# EasyEDA Pro project 超级电容组_v1.eprj

# Schematic 散热片
Create Date: 2024-05-23; Page Name: P1; Project Name: 超级电容组; Schematic Name: 背面; Update Date: 2024-05-23; Company: 嘉立创EDA; Page Size: A2; Version: V1.0
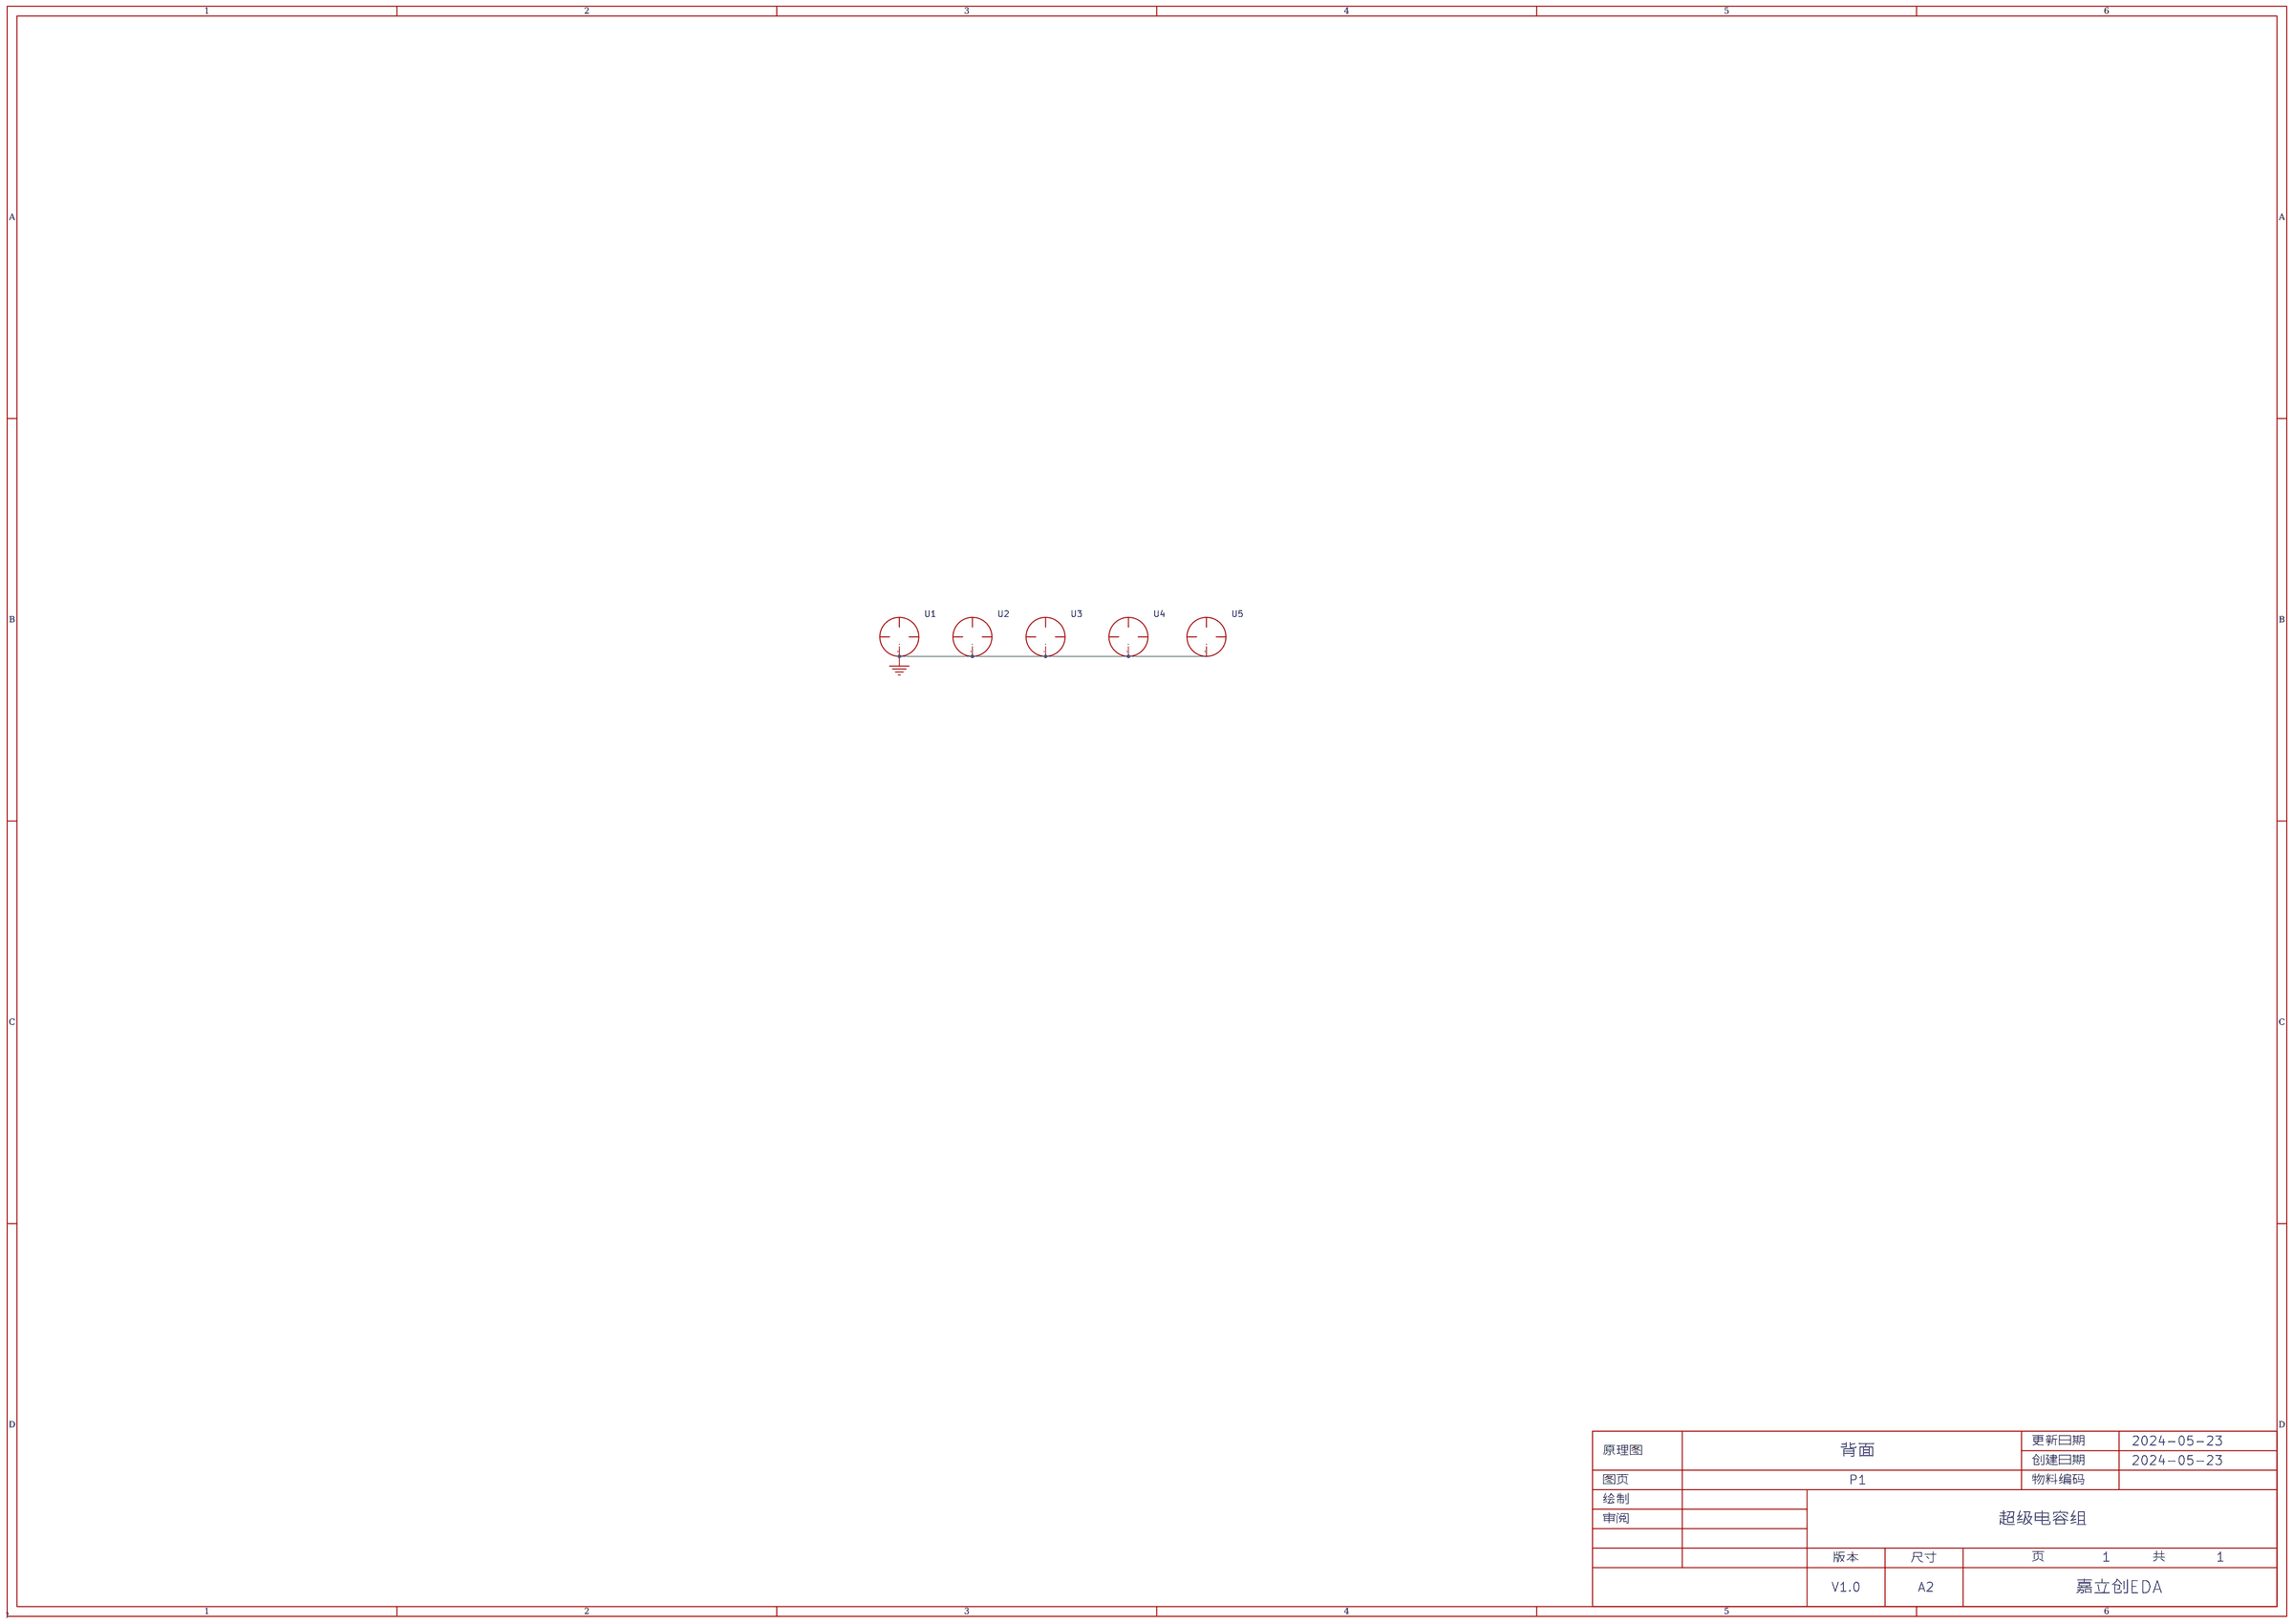
[diagram p0: schematic sheet]

## Parts
U1  -  [M2.5直径4.5高4孔3深1.2PCB螺母]
U2  -  [M2.5直径4.5高4孔3深1.2PCB螺母]
U3  -  [M2.5直径4.5高4孔3深1.2PCB螺母]
U4  -  [M2.5直径4.5高4孔3深1.2PCB螺母]
U5  -  [M2.5直径4.5高4孔3深1.2PCB螺母]

## Library data of the parts
U1-U5 = M2.5_Φ4.5_H4_Hold3*1.2

## Nets
GND: U1.1 U2.1 U3.1 U4.1 U5.1

# Schematic 电容组
Board Name: 电容组V2.0.2342; Create Date: 2023-10-10; Page Name: P1; Project Name: RM2024群星战队7S3V1890J超级电容组; Schematic Name: 电容组; Update Date: 2024-09-09; Company: 嘉立创EDA; Page Size: A2; Version: V1.0
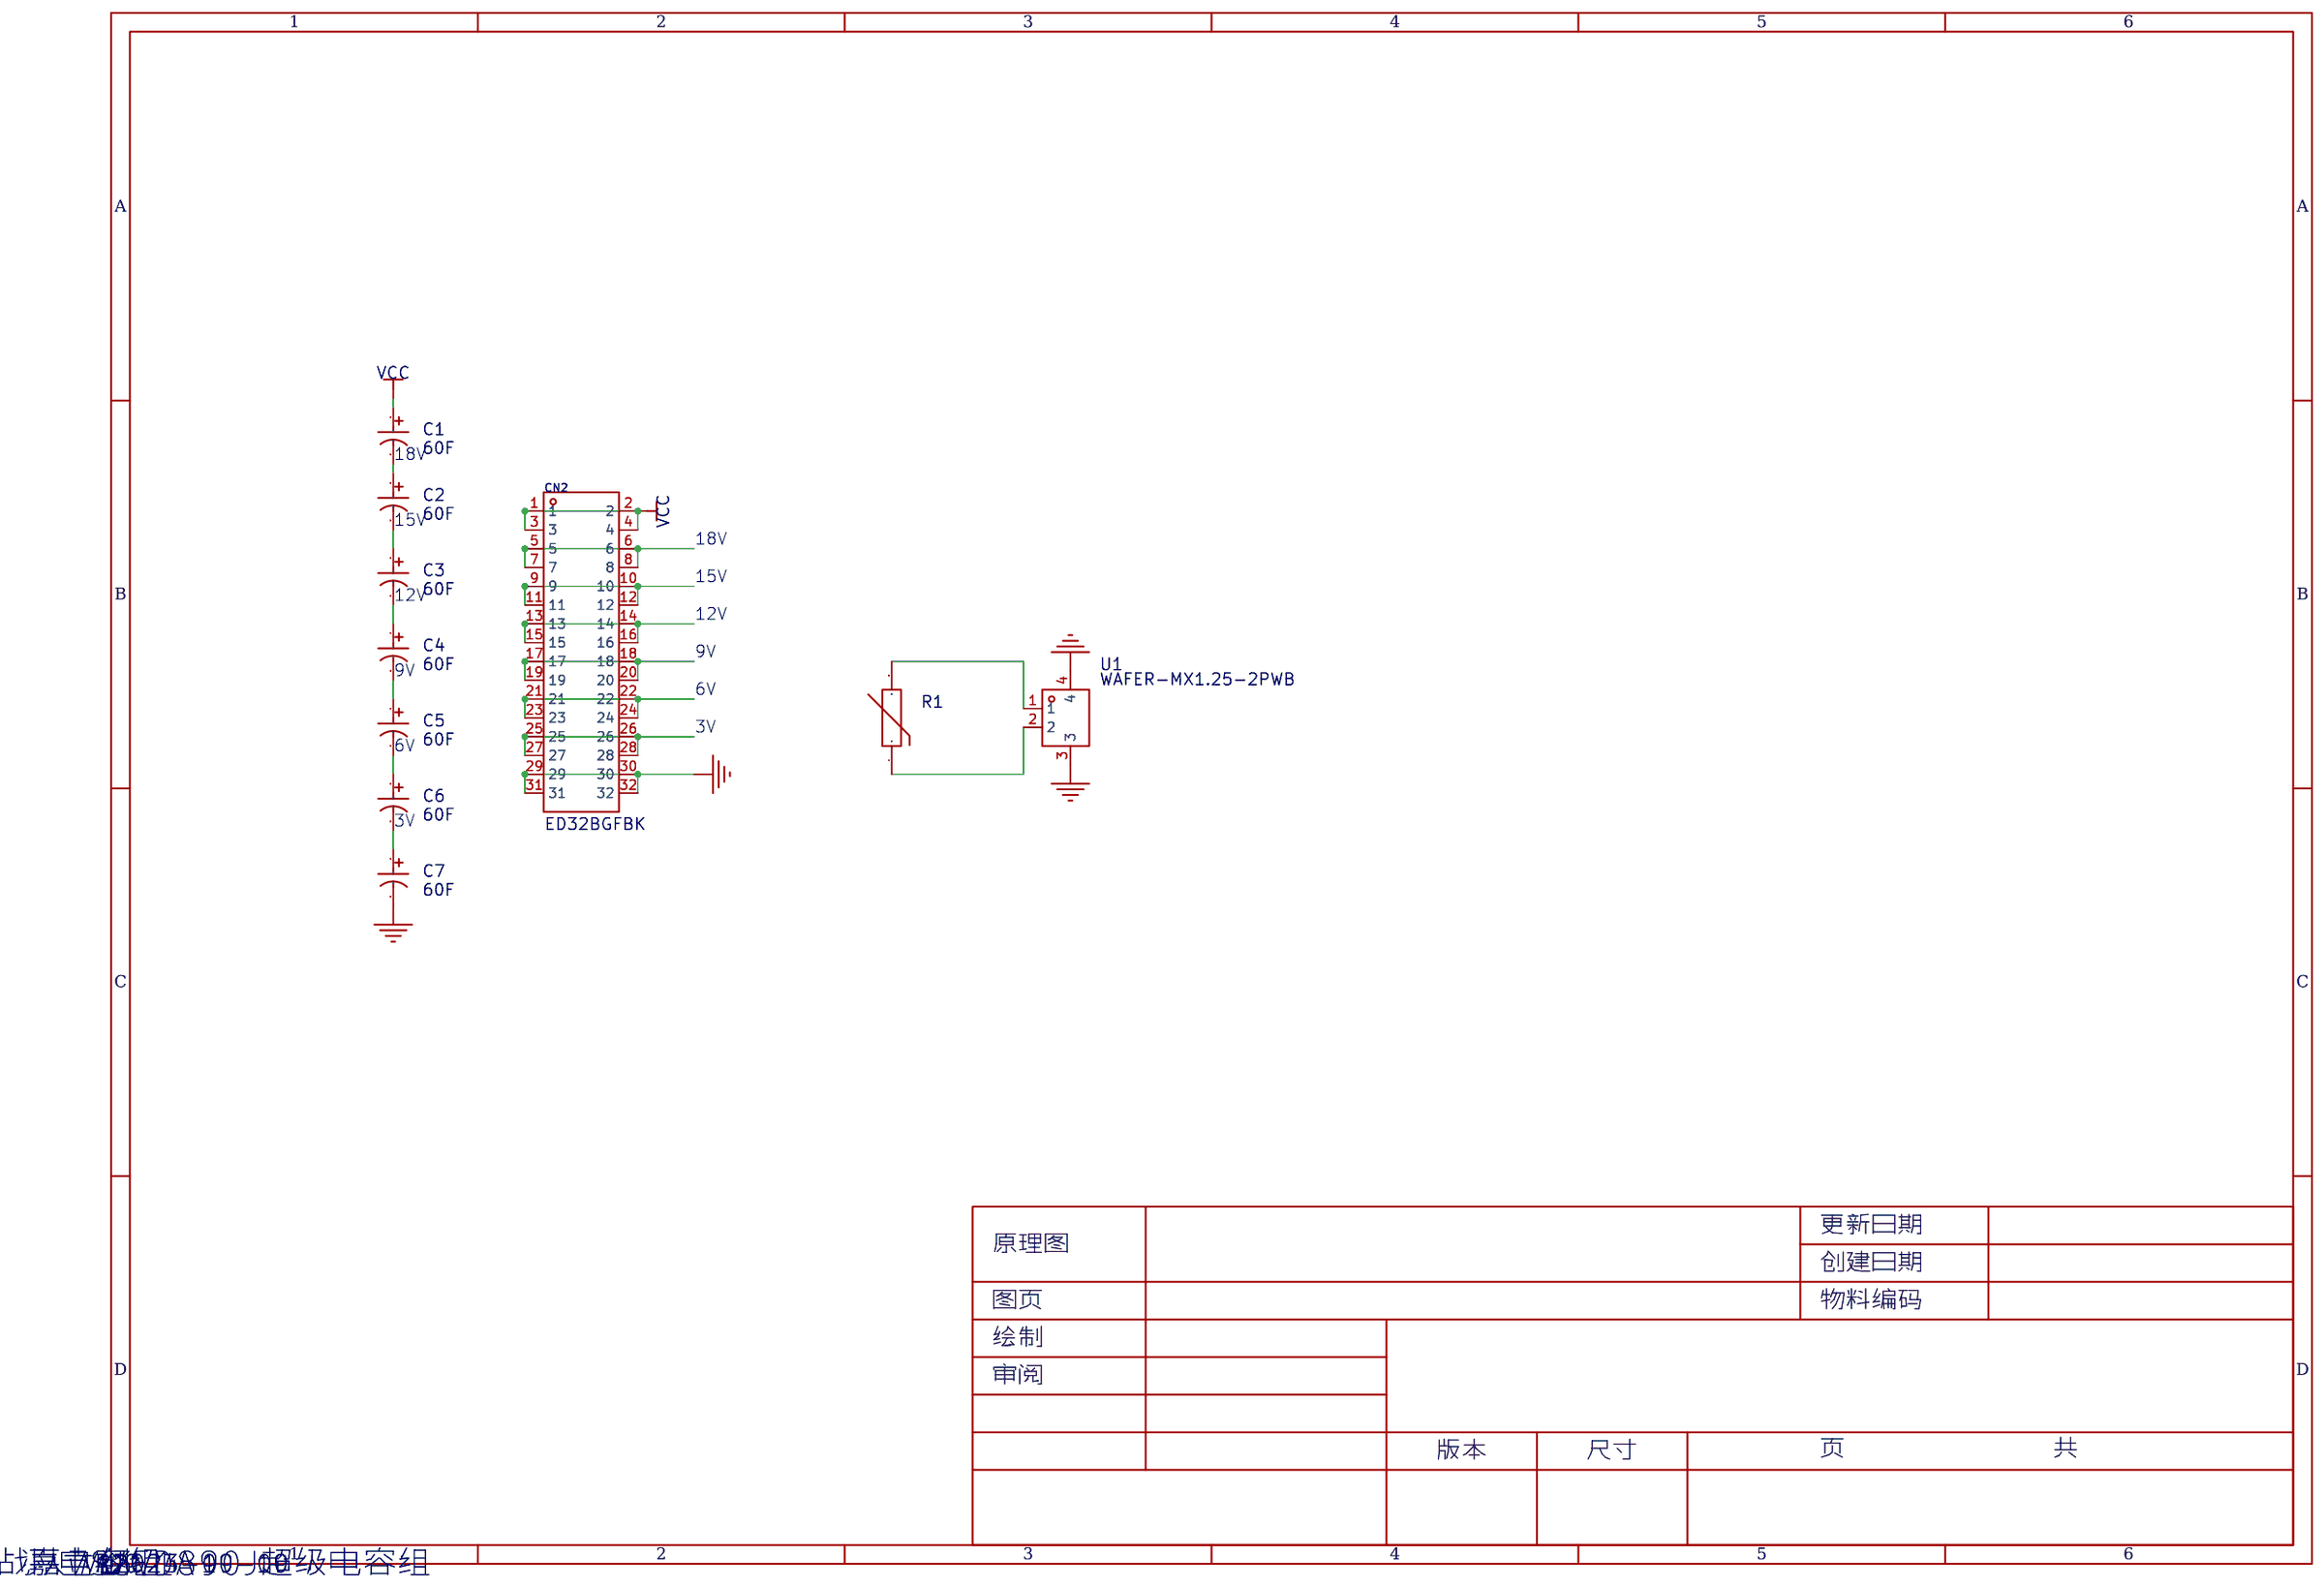
[diagram p1: schematic sheet]

## Parts
C1  60F  [CAP-TH_BD18.0-P7.50-D1.2-FD]
C2  60F  [CAP-TH_BD18.0-P7.50-D1.2-FD]
C3  60F  [CAP-TH_BD18.0-P7.50-D1.2-FD]
C4  60F  [CAP-TH_BD18.0-P7.50-D1.2-FD]
C5  60F  [CAP-TH_BD18.0-P7.50-D1.2-FD]
C6  60F  [CAP-TH_BD18.0-P7.50-D1.2-FD]
C7  60F  [CAP-TH_BD18.0-P7.50-D1.2-FD]
CN2  ED32BGFBK  [CONN-TH_32P-P2.54-ED32BGFBK]
R1  -  [RES-TH_L2.5-W2.5-P1.70-D0.3]
U1  WAFER-MX1.25-2PWB  [CONN-SMD_2P-P1.25_XUNPU_WAFER-MX1.25-2PWB]

## Library data of the parts
C1-C7 = 3V-60F: 容值:60F;精度:-10%~+30%;额定电压:2.7V;漏电流:1mA@72hrs;等效串联电阻:25mΩ@1kHz;; LCSC Part Name: 60F -10%~+30% 2.7V; Supplier Part: C7437611; Manufacturer: HCCCap(合众汇能); Supplier Footprint: 插件,P=7.5mm; JLCPCB Part Class: Extended Part; Supplier: LCSC; Tolerance: -10%~+30%; Rated Voltage: 3V; Leakage Current(DCL): 1mA@72hrs; Equivalent Series Resistance(ESR): 25mΩ@1kHz; Lifetime @ Temp: 1500hrs@70℃; Operating Temperature: -40℃~+70℃; φD: 18mm; L: 40mm; Lead Spacing: 7.5mm; Check: false
CN2 = ED32BGFBK: 连接器类型:EDGE SLOT;间距:2.54mm;引脚总数:32P;安装方式:直插;工作温度范围:-55℃~+125℃;; LCSC Part Name: 2.54mm P数:32P; Supplier Part: C5173300; Manufacturer: WingTAT(格林柏); Supplier Footprint: 插件,P=2.54mm; JLCPCB Part Class: 扩展库; Datasheet: https://atta.szlcsc.com/upload/public/pdf/source/20220923/BFC6E7AA43A5C38F911A443E7B1F065C.pdf; Supplier: LCSC; Connector Type: EDGE SLOT; Pitch: 2.54mm; Number of Pins: 32P; Mounting Style: 直插; Height Above Board: 15.6mm; Contact Material: 铜合金; Contact Plating: 金; Operating Temperature Range: -55℃~+125℃
R1 = MF51B3950-100K: 阻值(25℃):10kΩ;B值(25℃/50℃):3950K;电阻精度:±1%;功率:50mW;B值精度:±1%;最大稳态电流(25℃):-;; Check: false
U1 = WAFER-MX1.25-2PWB: 插针结构:1x2P;间距:1.25mm;安装方式:卧贴;总PIN数:2P;排数:1;每排PIN数:2;额定电流:1A;工作温度范围:-25℃~+85℃;; LCSC Part Name: 1x2P 间距:1.25mm 卧贴; Supplier Part: C3029359; Manufacturer: XUNPU(讯普); Supplier Footprint: SMD,P=1.25mm,卧贴; JLCPCB Part Class: 扩展库; Datasheet: https://atta.szlcsc.com/upload/public/pdf/source/20220527/5ACBB683E384B6AD06743F272F933620.pdf; Supplier: LCSC; Pins Structure: 1x2P; Pitch: 1.25mm; Mounting Style: 卧贴; Number of Pins: 2P; Number of Rows: 1; Number of PINs Per Row: 2; Current Rating (Max): 1A; Operating Temperature Range: -25℃~+85℃

## Nets
3V: C6.2 C7.1 CN2.25 CN2.26 CN2.27 CN2.28
6V: C5.2 C6.1 CN2.21 CN2.22 CN2.23 CN2.24
9V: C4.2 C5.1 CN2.17 CN2.18 CN2.19 CN2.20
12V: C3.2 C4.1 CN2.13 CN2.14 CN2.15 CN2.16
15V: C2.2 C3.1 CN2.9 CN2.10 CN2.11 CN2.12
18V: C1.2 C2.1 CN2.5 CN2.6 CN2.7 CN2.8
GND: C7.2 CN2.29 CN2.30 CN2.31 CN2.32 U1.3 U1.4
VCC: C1.1 CN2.1 CN2.2 CN2.3 CN2.4
$1N5929: R1.2 U1.1
$1N5933: R1.1 U1.2

# Schematic 被动均衡板
Board Name: 被动均衡板V2.1.2346; Create Date: 2025-11-18; Page Name: P1; Project Name: RM2024群星战队7S3V1890J超级电容组_copy; Schematic Name: 被动均衡板; Update Date: 2025-11-18; Company: 嘉立创EDA; Page Size: A2; Version: V1.0
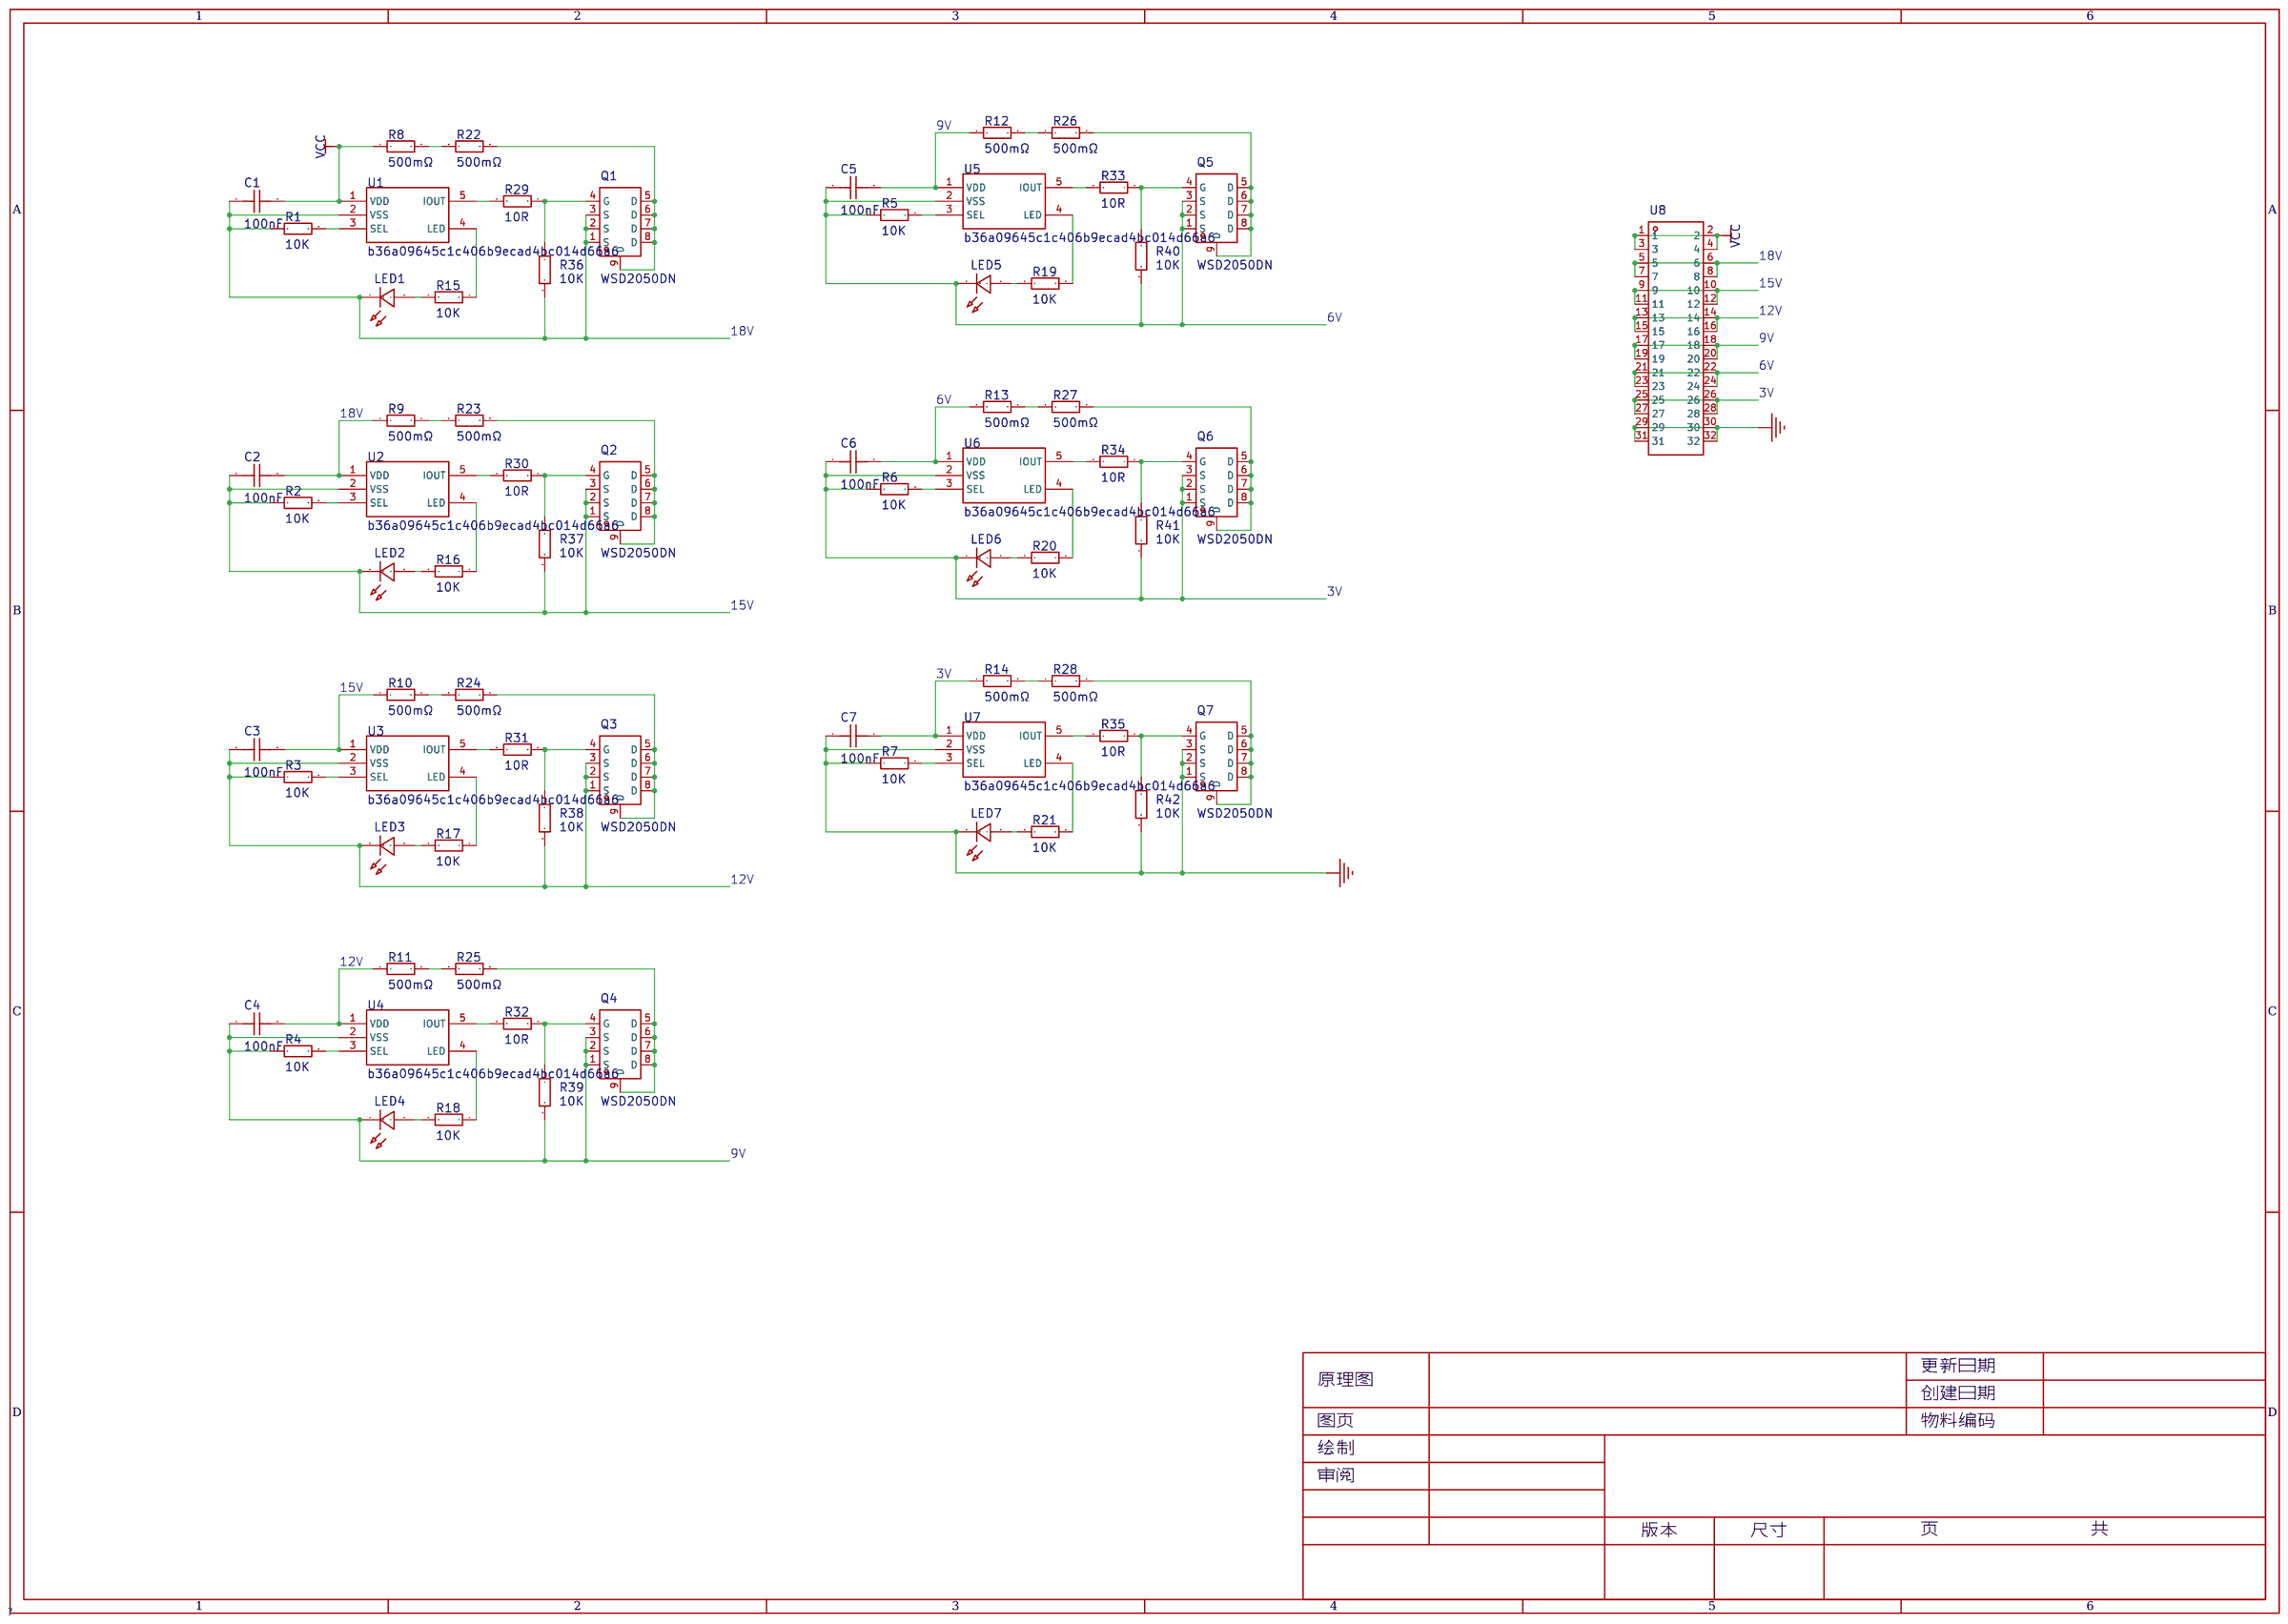
[diagram p2: schematic sheet]

## Parts
C1  100nF  [C0603]
C2  100nF  [C0603]
C3  100nF  [C0603]
C4  100nF  [C0603]
C5  100nF  [C0603]
C6  100nF  [C0603]
C7  100nF  [C0603]
LED1  -  [LED_0603]
LED2  -  [LED_0603]
LED3  -  [LED_0603]
LED4  -  [LED_0603]
LED5  -  [LED_0603]
LED6  -  [LED_0603]
LED7  -  [LED_0603]
Q1  WSD2050DN  [DFN-8_L3.0-W3.0-P0.65-BL]
Q2  WSD2050DN  [DFN-8_L3.0-W3.0-P0.65-BL]
Q3  WSD2050DN  [DFN-8_L3.0-W3.0-P0.65-BL]
Q4  WSD2050DN  [DFN-8_L3.0-W3.0-P0.65-BL]
Q5  WSD2050DN  [DFN-8_L3.0-W3.0-P0.65-BL]
Q6  WSD2050DN  [DFN-8_L3.0-W3.0-P0.65-BL]
Q7  WSD2050DN  [DFN-8_L3.0-W3.0-P0.65-BL]
R1  10K  [R0603]
R2  10K  [R0603]
R3  10K  [R0603]
R4  10K  [R0603]
R5  10K  [R0603]
R6  10K  [R0603]
R7  10K  [R0603]
R8  500mΩ  [RES-SMD_L6.4-W3.2_LR2512D-3W-1MR]
R9  500mΩ  [RES-SMD_L6.4-W3.2_LR2512D-3W-1MR]
R10  500mΩ  [RES-SMD_L6.4-W3.2_LR2512D-3W-1MR]
R11  500mΩ  [RES-SMD_L6.4-W3.2_LR2512D-3W-1MR]
R12  500mΩ  [RES-SMD_L6.4-W3.2_LR2512D-3W-1MR]
R13  500mΩ  [RES-SMD_L6.4-W3.2_LR2512D-3W-1MR]
R14  500mΩ  [RES-SMD_L6.4-W3.2_LR2512D-3W-1MR]
R15  10K  [R0603]
R16  10K  [R0603]
R17  10K  [R0603]
R18  10K  [R0603]
R19  10K  [R0603]
R20  10K  [R0603]
R21  10K  [R0603]
R22  500mΩ  [RES-SMD_L6.4-W3.2_LR2512D-3W-1MR]
R23  500mΩ  [RES-SMD_L6.4-W3.2_LR2512D-3W-1MR]
R24  500mΩ  [RES-SMD_L6.4-W3.2_LR2512D-3W-1MR]
R25  500mΩ  [RES-SMD_L6.4-W3.2_LR2512D-3W-1MR]
R26  500mΩ  [RES-SMD_L6.4-W3.2_LR2512D-3W-1MR]
R27  500mΩ  [RES-SMD_L6.4-W3.2_LR2512D-3W-1MR]
R28  500mΩ  [RES-SMD_L6.4-W3.2_LR2512D-3W-1MR]
R29  10R  [R0603]
R30  10R  [R0603]
R31  10R  [R0603]
R32  10R  [R0603]
R33  10R  [R0603]
R34  10R  [R0603]
R35  10R  [R0603]
R36  10K  [R0603]
R37  10K  [R0603]
R38  10K  [R0603]
R39  10K  [R0603]
R40  10K  [R0603]
R41  10K  [R0603]
R42  10K  [R0603]
U1  b36a09645c1c406b9ecad4bc014d66a6  [SOT-23-5_L2.9-W1.5-P0.95-LS2.8-BL]
U2  b36a09645c1c406b9ecad4bc014d66a6  [SOT-23-5_L2.9-W1.5-P0.95-LS2.8-BL]
U3  b36a09645c1c406b9ecad4bc014d66a6  [SOT-23-5_L2.9-W1.5-P0.95-LS2.8-BL]
U4  b36a09645c1c406b9ecad4bc014d66a6  [SOT-23-5_L2.9-W1.5-P0.95-LS2.8-BL]
U5  b36a09645c1c406b9ecad4bc014d66a6  [SOT-23-5_L2.9-W1.5-P0.95-LS2.8-BL]
U6  b36a09645c1c406b9ecad4bc014d66a6  [SOT-23-5_L2.9-W1.5-P0.95-LS2.8-BL]
U7  b36a09645c1c406b9ecad4bc014d66a6  [SOT-23-5_L2.9-W1.5-P0.95-LS2.8-BL]
U8  -  [WingTAT-32PIN]

## Library data of the parts
C1-C7 = CAP_0603: Supplier Footprint: 0603
LED1-LED7 = LED_0603-R: Supplier Footprint: 0603
Q1-Q7 = WSD2050DN: 类型:N沟道;漏源电压(Vdss):20V;连续漏极电流(Id):40A;功率(Pd):28W;导通电阻(RDS(on)@Vgs,Id):14mΩ@10V,7A;; LCSC Part Name: N沟道 20V 40A; Supplier Part: C377874; Manufacturer: WINSOK(微硕); Supplier Footprint: DFN-8(3x3); JLCPCB Part Class: 扩展库; Datasheet: https://atta.szlcsc.com/upload/public/pdf/source/20190416/C377874_B01A2B80EE2250BA6364EF2B6EB7606D.pdf; Supplier: LCSC; Type: N沟道; Drain Source Voltage (Vdss): 20V; Continuous Drain Current (Id): 40A; Power Dissipation (Pd): 28W; Drain Source On Resistance (RDS(on)@Vgs,Id): 14mΩ@10V,7A; Gate Threshold Voltage (Vgs(th)@Id): 1V@250uA
R1-R7 R15-R21 R29-R42 = Res_0603: Supplier Footprint: 0603
R8-R14 R22-R28 = HoJLR2512-3W-500mR-1%: 电阻类型:采样电阻;阻值:500mΩ;精度:±1%;功率:3W;安装方式:贴片;; LCSC Part Name: 500mΩ ±1% 3W; Supplier Part: C2904268; Manufacturer: Milliohm(毫欧); Supplier Footprint: 2512; JLCPCB Part Class: Extended Part; Datasheet: https://atta.szlcsc.com/upload/public/pdf/source/20211009/7525CABAB363C979E942C1DD41F1FEF0.pdf; Supplier: LCSC; Type: 采样电阻; Tolerance: ±1%; Power(Watts): 3W; Mounting Sytle: 贴片
U1-U7 = BW6103
U8 = WingTAT-32PIN

## Nets
3V: C6.1 C7.2 LED6.1(C) Q6.1(S) Q6.2(S) Q6.3(S) R6.1 R14.1 R41.2 U6.2(VSS) U7.1(VDD) U8.25 U8.26 U8.27 U8.28
6V: C5.1 C6.2 LED5.1(C) Q5.1(S) Q5.2(S) Q5.3(S) R5.1 R13.1 R40.2 U5.2(VSS) U6.1(VDD) U8.21 U8.22 U8.23 U8.24
9V: C4.1 C5.2 LED4.1(C) Q4.1(S) Q4.2(S) Q4.3(S) R4.1 R12.1 R39.2 U4.2(VSS) U5.1(VDD) U8.17 U8.18 U8.19 U8.20
12V: C3.1 C4.2 LED3.1(C) Q3.1(S) Q3.2(S) Q3.3(S) R3.1 R11.1 R38.2 U3.2(VSS) U4.1(VDD) U8.13 U8.14 U8.15 U8.16
15V: C2.1 C3.2 LED2.1(C) Q2.1(S) Q2.2(S) Q2.3(S) R2.1 R10.1 R37.2 U2.2(VSS) U3.1(VDD) U8.9 U8.10 U8.11 U8.12
18V: C1.1 C2.2 LED1.1(C) Q1.1(S) Q1.2(S) Q1.3(S) R1.1 R9.1 R36.2 U1.2(VSS) U2.1(VDD) U8.5 U8.6 U8.7 U8.8
GND: C7.1 LED7.1(C) Q7.1(S) Q7.2(S) Q7.3(S) R7.1 R42.2 U7.2(VSS) U8.29 U8.30 U8.31 U8.32
VCC: C1.2 R8.1 U1.1(VDD) U8.1 U8.2 U8.3 U8.4
$1N349: R1.2 U1.3(SEL)
$1N404: LED1.2(A) R15.2
$1N437: R15.1 U1.4(LED)
$1N622: R29.2 U1.5(IOUT)
$1N3003: R8.2 R22.1
$1N3309: R2.2 U2.3(SEL)
$1N3311: LED2.2(A) R16.2
$1N3313: R16.1 U2.4(LED)
$1N3315: R30.2 U2.5(IOUT)
$1N3349: R9.2 R23.1
$1N3959: R3.2 U3.3(SEL)
$1N3961: LED3.2(A) R17.2
$1N3963: R17.1 U3.4(LED)
$1N3965: R31.2 U3.5(IOUT)
$1N3999: R10.2 R24.1
$1N4001: R4.2 U4.3(SEL)
$1N4003: LED4.2(A) R18.2
$1N4005: R18.1 U4.4(LED)
$1N4007: R32.2 U4.5(IOUT)
$1N4041: R11.2 R25.1
$1N4651: R5.2 U5.3(SEL)
$1N4653: LED5.2(A) R19.2
$1N4655: R19.1 U5.4(LED)
$1N4657: R33.2 U5.5(IOUT)
$1N4691: R12.2 R26.1
$1N4693: R6.2 U6.3(SEL)
$1N4695: LED6.2(A) R20.2
$1N4697: R20.1 U6.4(LED)
$1N4699: R34.2 U6.5(IOUT)
$1N4733: R13.2 R27.1
$1N5343: R7.2 U7.3(SEL)
$1N5345: LED7.2(A) R21.2
$1N5347: R21.1 U7.4(LED)
$1N5349: R35.2 U7.5(IOUT)
$1N5351: Q7.4(G) R35.1 R42.1
$1N5383: R14.2 R28.1
$1N15313: Q7.5(D) Q7.6(D) Q7.7(D) Q7.8(D) Q7.9(D) R28.2
$1N15636: Q6.4(G) R34.1 R41.1
$1N15639: Q6.5(D) Q6.6(D) Q6.7(D) Q6.8(D) Q6.9(D) R27.2
$1N16130: Q1.4(G) R29.1 R36.1
$1N16133: Q1.5(D) Q1.6(D) Q1.7(D) Q1.8(D) Q1.9(D) R22.2
$1N16291: Q2.4(G) R30.1 R37.1
$1N16294: Q2.5(D) Q2.6(D) Q2.7(D) Q2.8(D) Q2.9(D) R23.2
$1N16454: Q3.4(G) R31.1 R38.1
$1N16457: Q3.5(D) Q3.6(D) Q3.7(D) Q3.8(D) Q3.9(D) R24.2
$1N16617: Q4.4(G) R32.1 R39.1
$1N16620: Q4.5(D) Q4.6(D) Q4.7(D) Q4.8(D) Q4.9(D) R25.2
$1N16780: Q5.4(G) R33.1 R40.1
$1N16783: Q5.5(D) Q5.6(D) Q5.7(D) Q5.8(D) Q5.9(D) R26.2

# Board PCB1
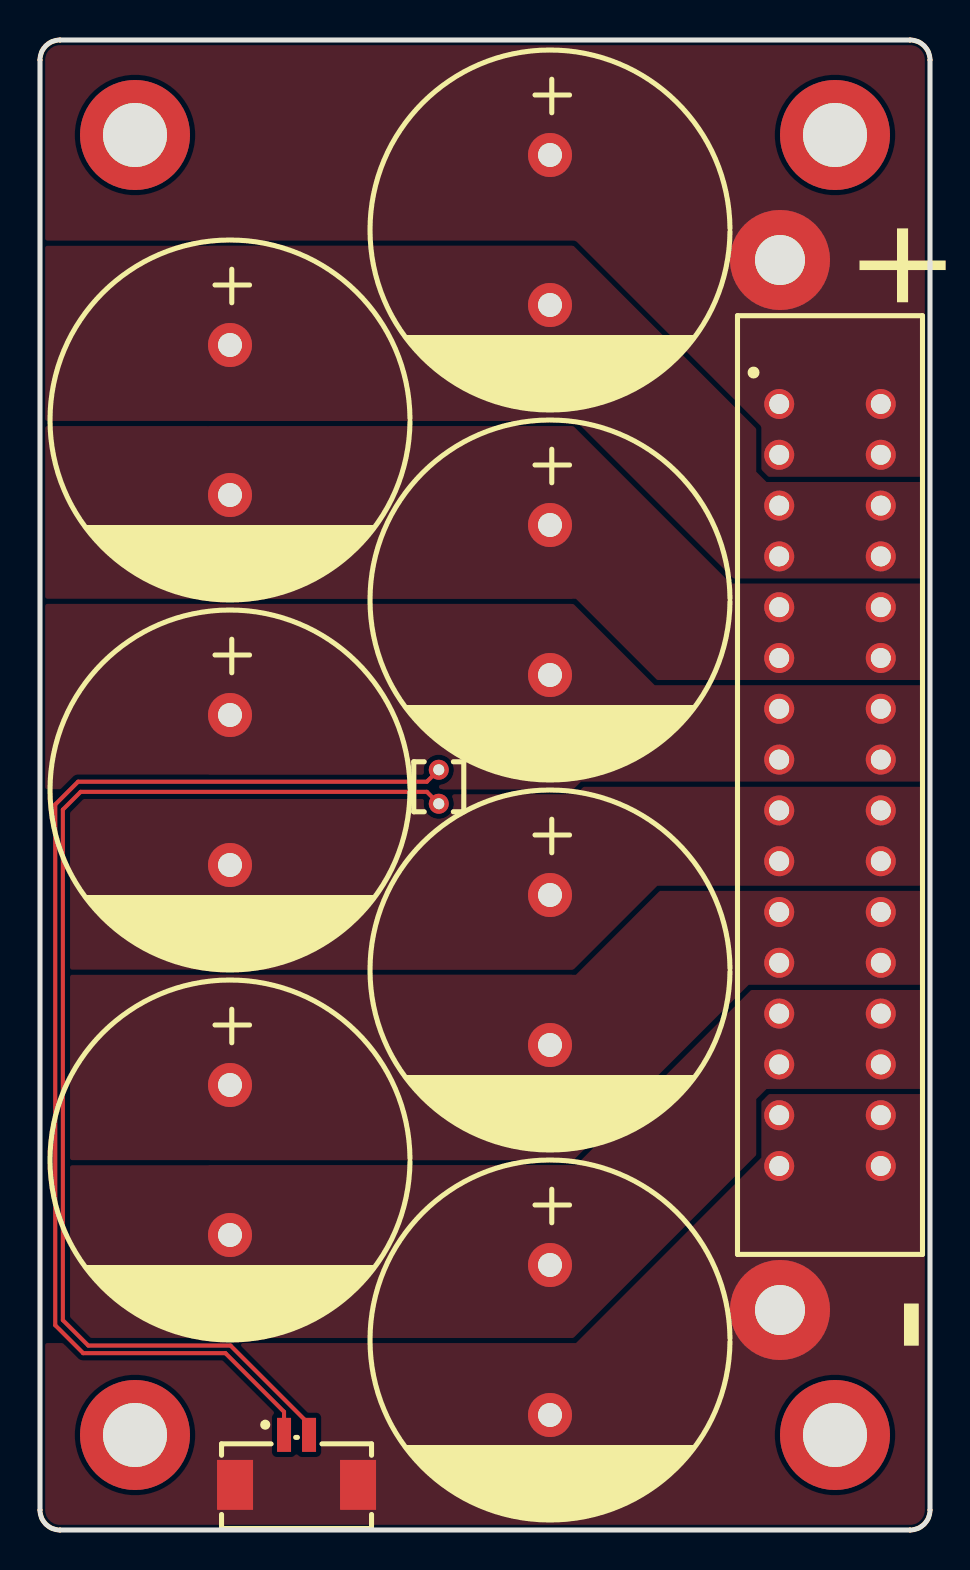
[diagram p3: board, top side]
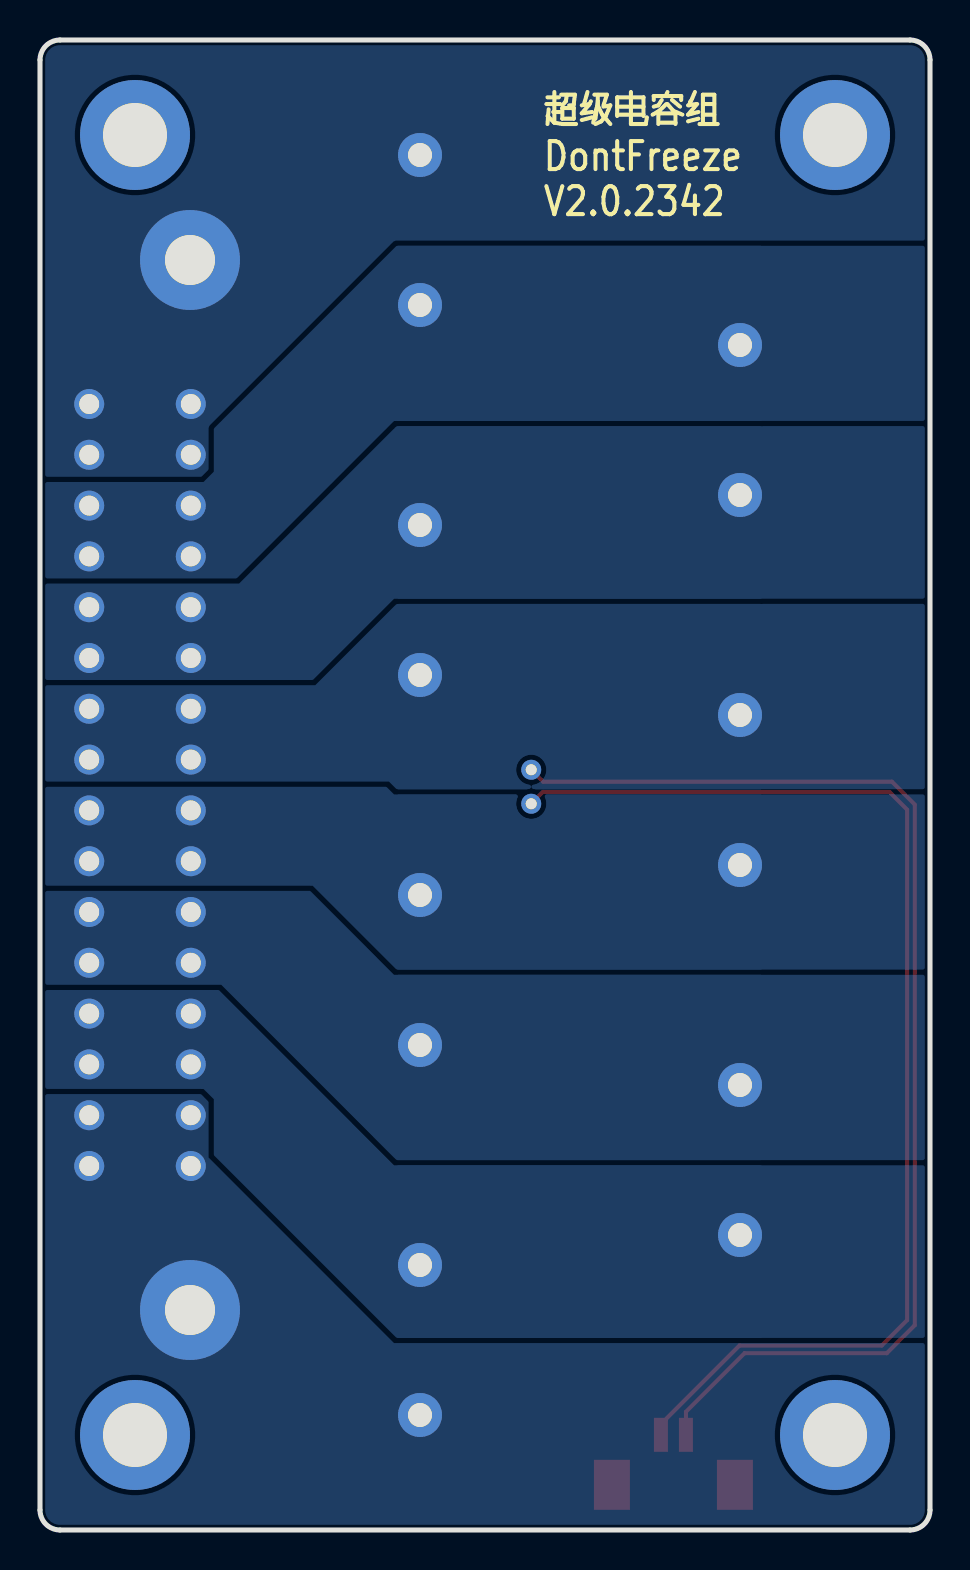
[diagram p4: board, bottom side, seen from below]

Outline 44.5 x 74.5 mm; copper layers: Top Layer, Bottom Layer. Coordinates in mm from the lower left corner of the outline.
Outline path: 0,73.5 0,1 arc(0.29,0.29) 1,0 43.5,0 arc(44.21,0.29) 44.5,1 44.5,73.5 arc(44.21,74.21) 43.5,74.5 1,74.5 arc(0.29,74.21) 0,73.5
Stack: Top Layer 0.035mm / Bottom Layer 0.035mm

## Design rules (mm)
spacing copperThickness1oz (default): track to track 0.102, other pairs 0.152 to 0.3
spacing copperThickness2oz: track to track 0.203, other pairs 0.152 to 0.3
spacing Plane_innerPlane: track to track 0.102, other pairs 0.152 to 0.3
spacing Copper_copperRegion: track to track 0.102, other pairs 0.152 to 0.3
spacing Copper_全连接: track to track 0.102, other pairs 0.152 to 0.3
track width copperThickness1oz (default): min 0.127, default 0.254, max 25.4
track width copperThickness2oz: min 0.203, default 0.254, max 2.54
differential pair differentialPair (default): width min 0.127, default 0.254, max 2.54; gap min 0.152, default 0.152
net GND uses 全连接
net 3V uses 全连接
net 6V uses 全连接
net 9V uses 全连接
net 12V uses 全连接
net 15V uses 全连接
net 18V uses 全连接
net VCC uses 全连接
pour e32 uses 全连接
pour e30 uses 全连接

## Placement (name value [footprint] x y rotation side)
C1  60F  [CAP-TH_BD18.0-P7.50-D1.2-FD]  25.5 65 270 top
C2  60F  [CAP-TH_BD18.0-P7.50-D1.2-FD]  9.5 55.5 270 top
C3  60F  [CAP-TH_BD18.0-P7.50-D1.2-FD]  25.5 46.5 270 top
C4  60F  [CAP-TH_BD18.0-P7.50-D1.2-FD]  9.5 37 270 top
C5  60F  [CAP-TH_BD18.0-P7.50-D1.2-FD]  25.5 28 270 top
C6  60F  [CAP-TH_BD18.0-P7.50-D1.2-FD]  9.5 18.5 270 top
C7  60F  [CAP-TH_BD18.0-P7.50-D1.2-FD]  25.5 9.5 270 top
CN2  ED32BGFBK  [CONN-TH_32P-P2.54-ED32BGFBK]  39.5 37.25 270 top
NOREF  -  [Pad_e1]  37 63.5 0 top
NOREF#2  -  [Pad_e2]  37 11 0 top
NOREF#3  -  [Pad_e3]  4.75 69.75 0 top
NOREF#4  -  [Pad_e5]  4.75 4.75 0 top
NOREF#5  -  [Pad_e4]  39.75 69.75 0 top
NOREF#6  -  [Pad_e6]  39.75 4.75 0 top
R1  -  [RES-TH_L2.5-W2.5-P1.70-D0.3]  19.94 37.16 90 top
U1  WAFER-MX1.25-2PWB  [CONN-SMD_2P-P1.25_XUNPU_WAFER-MX1.25-2PWB]  12.83 3.51 0 top

## Footprints (pads in the part's own frame, mm; a bottom-side part is the same pattern mirrored in y, then rotated)
CAP-TH_BD18.0-P7.50-D1.2-FD
  round 2.2 hole 1.2: 1(-3.75,0) 2(3.75,0)
CONN-SMD_2P-P1.25_XUNPU_WAFER-MX1.25-2PWB
  rect 0.7x1.7 smd: 1(-0.625,1.25) 2(0.625,1.25)
  rect 1.8x2.5 smd: 3(3.075,-1.25) 4(-3.075,-1.25)
CONN-TH_32P-P2.54-ED32BGFBK
  round 1.5 hole 1: 1(-19.05,-2.54) 2(-19.05,2.54) 3(-16.51,-2.54) 4(-16.51,2.54) 5(-13.97,-2.54) 6(-13.97,2.54) 7(-11.43,-2.54) 8(-11.43,2.54) 9(-8.89,-2.54) 10(-8.89,2.54) 11(-6.35,-2.54) 12(-6.35,2.54) 13(-3.81,-2.54) 14(-3.81,2.54) 15(-1.27,-2.54) 16(-1.27,2.54) 17(1.27,-2.54) 18(1.27,2.54) 19(3.81,-2.54) 20(3.81,2.54) 21(6.35,-2.54) 22(6.35,2.54) 23(8.89,-2.54) 24(8.89,2.54) 25(11.43,-2.54) 26(11.43,2.54) 27(13.97,-2.54) 28(13.97,2.54) 29(16.51,-2.54) 30(16.51,2.54) 31(19.05,-2.54) 32(19.05,2.54)
Pad_e1
  round 5 hole 2.5: 2(0,0)
Pad_e2
  round 5 hole 2.5: 2(0,0)
Pad_e3
  round 5.5 hole 3.2: 1(0,0)
Pad_e4
  round 5.5 hole 3.2: 2(0,0)
Pad_e5
  round 5.5 hole 3.2: 3(0,0)
Pad_e6
  round 5.5 hole 3.2: 4(0,0)
RES-TH_L2.5-W2.5-P1.70-D0.3
  round 1 hole 0.55: 1(-0.85,0) 2(0.85,0)

## Nets
As in the schematic, except:
GND: C7.2 CN2.29 CN2.30 CN2.31 CN2.32 NOREF#2.2 U1.3 U1.4
VCC: C1.1 CN2.1 CN2.2 CN2.3 CN2.4 NOREF.2

Pads without a net: NOREF#3 1; NOREF#4 3; NOREF#5 2; NOREF#6 4

## Routing (per net, layer and track width the routed paths; a pad name or vN(x,y) marks a point on that pad's centre or on a via; arc(x,y) is an arc through that point)
$1N5929: length 60.3
  Top Layer w0.203: R1.2 19.34,37.42 1.91,37.42 0.76,36.27 0.76,10.24 2.16,8.84 9.27,8.84 12.2,5.91 U1.1
$1N5933: length 59.9
  Top Layer w0.203: R1.1 19.34,36.91 2.03,36.91 1.14,36.02 1.14,10.49 2.41,9.22 9.53,9.22 13.45,5.29 U1.2

## Copper pours and planes (outline as drawn; the poured copper is in the pictures)
3V on Top Layer: 8.38,18.24 26.67,18.24 26.67,9.6 8.38,9.6
3V on Top Layer: 26.67,9.6 35.81,18.75 35.81,21.54 36.32,22.05 44.45,22.05 45.47,23.06 45.47,26.62 45.09,27 35.56,27 26.8,18.24 -1.27,18.24 -1.65,17.86 -1.65,11 -0.25,9.6
3V on Bottom Layer: 8.38,18.24 26.67,18.24 26.67,9.6 8.38,9.6
3V on Bottom Layer: 26.67,9.6 35.81,18.75 35.81,21.54 36.32,22.05 44.45,22.05 45.47,23.06 45.47,26.62 45.09,27 35.56,27 26.8,18.24 -1.27,18.24 -1.65,17.86 -1.65,11 -0.25,9.6
6V on Top Layer: 8.38,27.76 26.67,27.76 26.67,18.49 8.38,18.49
6V on Top Layer: 26.8,27.76 30.99,31.95 44.83,31.95 45.72,31.07 45.72,28.53 44.45,27.26 35.43,27.26 26.67,18.49 -1.02,18.49 -2.03,19.51 -2.03,26.49 -0.76,27.76
6V on Bottom Layer: 26.8,27.76 30.99,31.95 44.83,31.95 45.72,31.07 45.72,28.53 44.45,27.26 35.43,27.26 26.67,18.49 -1.02,18.49 -2.03,19.51 -2.03,26.49 -0.76,27.76
6V on Bottom Layer: 8.38,27.76 26.67,27.76 26.67,18.49 8.38,18.49
9V on Top Layer: 26.67,28.02 30.86,32.21 44.58,32.21 45.34,32.97 45.34,37.03 45.21,37.16 27.18,37.16 26.8,36.78 -1.14,36.78 -1.91,36.02 -1.91,29.16 -0.76,28.02
9V on Top Layer: 8.38,36.78 26.67,36.78 26.67,28.02 8.38,28.02
9V on Bottom Layer: 26.67,28.02 30.86,32.21 44.58,32.21 45.34,32.97 45.34,37.03 45.21,37.16 27.18,37.16 26.8,36.78 -1.14,36.78 -1.91,36.02 -1.91,29.16 -0.76,28.02
9V on Bottom Layer: 8.38,36.78 26.67,36.78 26.67,28.02 8.38,28.02
12V on Top Layer: 8.38,46.31 26.67,46.31 26.67,37.03 8.38,37.03
12V on Top Layer: 26.67,37.03 27.05,37.42 44.45,37.42 45.09,38.05 45.09,42.24 30.73,42.24 26.67,46.31 -1.4,46.31 -2.03,45.67 -2.03,38.05 -1.02,37.03
12V on Bottom Layer: 26.67,37.03 27.05,37.42 44.45,37.42 45.09,38.05 45.09,42.24 30.73,42.24 26.67,46.31 -1.4,46.31 -2.03,45.67 -2.03,38.05 -1.02,37.03
12V on Bottom Layer: 8.38,46.31 26.67,46.31 26.67,37.03 8.38,37.03
15V on Top Layer: 8.38,55.2 26.67,55.2 26.67,46.56 8.38,46.56
15V on Top Layer: 26.8,46.56 30.86,42.5 44.2,42.5 45.21,43.51 45.21,47.32 34.54,47.32 26.67,55.2 -0.51,55.2 -1.91,53.8 -1.91,47.83 -0.63,46.56
15V on Bottom Layer: 8.38,55.2 26.67,55.2 26.67,46.56 8.38,46.56
15V on Bottom Layer: 26.8,46.56 30.86,42.5 44.2,42.5 45.21,43.51 45.21,47.32 34.54,47.32 26.67,55.2 -0.51,55.2 -1.91,53.8 -1.91,47.83 -0.63,46.56
18V on Top Layer: 8.38,64.21 26.67,64.21 26.67,55.45 8.38,55.45
18V on Top Layer: 26.8,55.45 34.67,47.58 44.58,47.58 45.47,48.47 45.47,52.02 45.09,52.4 36.32,52.4 35.81,52.91 35.81,55.07 26.67,64.21 -1.14,64.21 -3.05,62.31 -3.05,57.86 -0.63,55.45
18V on Bottom Layer: 26.8,55.45 34.67,47.58 44.58,47.58 45.47,48.47 45.47,52.02 45.09,52.4 36.32,52.4 35.81,52.91 35.81,55.07 26.67,64.21 -1.14,64.21 -3.05,62.31 -3.05,57.86 -0.63,55.45
18V on Bottom Layer: 8.38,64.21 26.67,64.21 26.67,55.45 8.38,55.45
GND on Top Layer: 26.8,9.35 36.07,18.62 36.07,21.41 36.45,21.8 44.96,21.8 45.47,21.29 45.47,-1.32 43.69,-3.1 0,-3.1 -2.29,-0.81 -2.29,8.08 -1.02,9.35
GND on Bottom Layer: 26.8,9.35 36.07,18.62 36.07,21.41 36.45,21.8 44.96,21.8 45.47,21.29 45.47,-1.32 43.69,-3.1 0,-3.1 -2.29,-0.81 -2.29,8.08 -1.02,9.35
VCC on Top Layer: -2.92,79.58 51.94,79.58 51.94,51 -2.92,51
VCC on Bottom Layer: -2.92,79.58 51.94,79.58 51.94,51 -2.92,51

## Text on the board
Bottom Silkscreen Layer: 超级电容组 / DontFreeze / V2.0.2342
Top Silkscreen Layer: + | -

# Board 被动均衡板
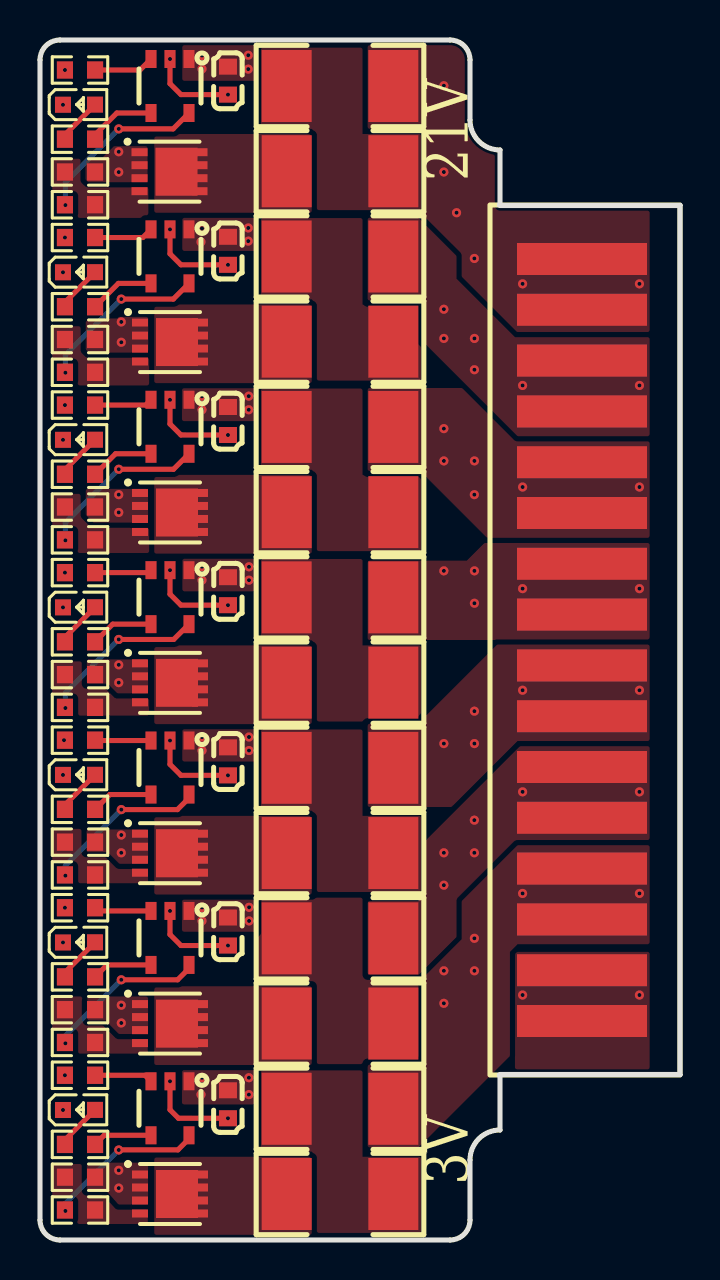
[diagram p5: board, top side]
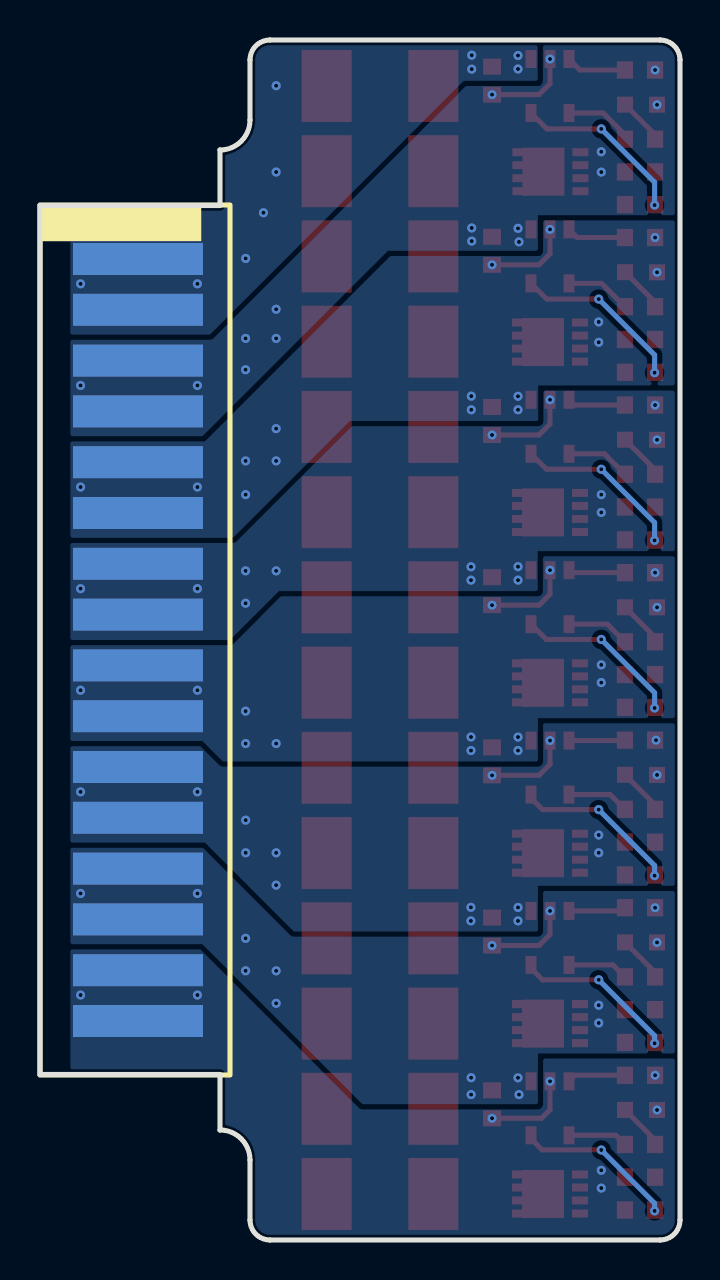
[diagram p6: board, bottom side, seen from below]

Outline 32 x 60 mm; copper layers: Top Layer, Bottom Layer. Coordinates in mm from the lower left corner of the outline.
Outline path: 0,59 0,1 arc(0.29,0.29) 1,0 20.5,0 arc(21.21,0.29) 21.5,1 21.5,4 arc(21.94,5.06) 23,5.5 23,8.28 32,8.28 32,51.72 23,51.72 23,54.5 arc(21.94,54.94) 21.5,56 21.5,59 arc(21.21,59.71) 20.5,60 1,60 arc(0.29,59.71) 0,59
Stack: Top Layer 0.035mm / Dielectric2 1.51mm FR4 er 4.5 / Bottom Layer 0.035mm

## Design rules (mm)
template: 用户自定义配置
spacing copperThickness1oz (default): track to track 0.102, other pairs 0.152 to 0.3
spacing copperThickness2oz: track to track 0.203, other pairs 0.152 to 0.3
spacing Plane_innerPlane: track to track 0.102, other pairs 0.152 to 0.3
spacing Copper_copperRegion: track to track 0.102, other pairs 0.152 to 0.3
spacing Copper_全连接: track to track 0.102, other pairs 0.152 to 0.3
spacing Copper_全连接间距6mil: track to track 0.102, other pairs 0.152 to 0.3
track width copperThickness1oz (default): min 0.127, default 0.254, max 2.54
track width copperThickness2oz: min 0.203, default 0.254, max 2.54
differential pair differentialPair (default): width min 0.127, default 0.254, max 2.54; gap min 0.152, default 0.152
via viaSize (default): diameter min 0.457, default 0.457, max 10; hole min 0.203, default 0.203, max 6.299
net $1N3003 uses 全连接间距6mil
net $1N3349 uses 全连接间距6mil
net $1N3999 uses 全连接间距6mil
net $1N4041 uses 全连接间距6mil
net $1N4691 uses 全连接间距6mil
net $1N5351 uses 全连接
net $1N5383 uses 全连接间距6mil
net 18V uses 全连接
net VCC uses 全连接间距6mil
net 15V uses 全连接
net 12V uses 全连接
net 9V uses 全连接
net 6V uses 全连接
net 3V uses 全连接
net GND uses 全连接
net $1N15313 uses 全连接
net $1N15639 uses 全连接
net $1N15636 uses 全连接
net $1N16133 uses 全连接
net $1N16294 uses 全连接
net $1N16457 uses 全连接
net $1N16620 uses 全连接
net $1N16783 uses 全连接
net $1N16780 uses 全连接

## Placement (name value [footprint] x y rotation side)
C1  100nF  [C0603]  9.4 57.97 90 top
C2  100nF  [C0603]  9.4 49.46 90 top
C3  100nF  [C0603]  9.4 40.95 90 top
C4  100nF  [C0603]  9.4 32.44 90 top
C5  100nF  [C0603]  9.4 23.93 90 top
C6  100nF  [C0603]  9.4 15.42 90 top
C7  100nF  [C0603]  9.4 6.79 90 top
LED1  -  [LED_0603]  2 56.77 0 top
LED2  -  [LED_0603]  2 48.4 0 top
LED3  -  [LED_0603]  2 40.02 0 top
LED4  -  [LED_0603]  2 31.64 0 top
LED5  -  [LED_0603]  2 23.27 0 top
LED6  -  [LED_0603]  2 14.89 0 top
LED7  -  [LED_0603]  2 6.51 0 top
Q1  WSD2050DN  [DFN-8_L3.0-W3.0-P0.65-BL]  6.48 53.42 270 top
Q2  WSD2050DN  [DFN-8_L3.0-W3.0-P0.65-BL]  6.5 44.9 270 top
Q3  WSD2050DN  [DFN-8_L3.0-W3.0-P0.65-BL]  6.5 36.38 270 top
Q4  WSD2050DN  [DFN-8_L3.0-W3.0-P0.65-BL]  6.5 27.86 270 top
Q5  WSD2050DN  [DFN-8_L3.0-W3.0-P0.65-BL]  6.5 19.34 270 top
Q6  WSD2050DN  [DFN-8_L3.0-W3.0-P0.65-BL]  6.5 10.82 270 top
Q7  WSD2050DN  [DFN-8_L3.0-W3.0-P0.65-BL]  6.5 2.3 270 top
R1  10K  [R0603]  2 58.5 0 top
R2  10K  [R0603]  2 50.12 0 top
R3  10K  [R0603]  2 41.75 0 top
R4  10K  [R0603]  2 33.37 0 top
R5  10K  [R0603]  2 24.99 0 top
R6  10K  [R0603]  2 16.61 0 top
R7  10K  [R0603]  2 8.24 0 top
R8  500mΩ  [RES-SMD_L6.4-W3.2_LR2512D-3W-1MR]  15 57.7 180 top
R9  500mΩ  [RES-SMD_L6.4-W3.2_LR2512D-3W-1MR]  15 49.18 180 top
R10  500mΩ  [RES-SMD_L6.4-W3.2_LR2512D-3W-1MR]  15 40.65 180 top
R11  500mΩ  [RES-SMD_L6.4-W3.2_LR2512D-3W-1MR]  15 32.13 180 top
R12  500mΩ  [RES-SMD_L6.4-W3.2_LR2512D-3W-1MR]  15 23.61 180 top
R13  500mΩ  [RES-SMD_L6.4-W3.2_LR2512D-3W-1MR]  15 15.08 180 top
R14  500mΩ  [RES-SMD_L6.4-W3.2_LR2512D-3W-1MR]  15 6.56 180 top
R15  10K  [R0603]  2 55.04 180 top
R16  10K  [R0603]  2 46.66 180 top
R17  10K  [R0603]  2 38.29 180 top
R18  10K  [R0603]  2 29.91 180 top
R19  10K  [R0603]  2 21.53 180 top
R20  10K  [R0603]  2 13.16 180 top
R21  10K  [R0603]  2 4.78 180 top
R22  500mΩ  [RES-SMD_L6.4-W3.2_LR2512D-3W-1MR]  15 53.44 180 top
R23  500mΩ  [RES-SMD_L6.4-W3.2_LR2512D-3W-1MR]  15 44.92 180 top
R24  500mΩ  [RES-SMD_L6.4-W3.2_LR2512D-3W-1MR]  15 36.39 180 top
R25  500mΩ  [RES-SMD_L6.4-W3.2_LR2512D-3W-1MR]  15 27.87 180 top
R26  500mΩ  [RES-SMD_L6.4-W3.2_LR2512D-3W-1MR]  15 19.35 180 top
R27  500mΩ  [RES-SMD_L6.4-W3.2_LR2512D-3W-1MR]  15 10.82 180 top
R28  500mΩ  [RES-SMD_L6.4-W3.2_LR2512D-3W-1MR]  15 2.3 180 top
R29  10R  [R0603]  2 51.76 180 top
R30  10R  [R0603]  2 43.39 180 top
R31  10R  [R0603]  2 35.01 180 top
R32  10R  [R0603]  2 26.63 180 top
R33  10R  [R0603]  2 18.25 180 top
R34  10R  [R0603]  2 9.88 180 top
R35  10R  [R0603]  2 1.5 180 top
R36  10K  [R0603]  2 53.4 0 top
R37  10K  [R0603]  2 45.02 0 top
R38  10K  [R0603]  2 36.65 0 top
R39  10K  [R0603]  2 28.27 0 top
R40  10K  [R0603]  2 19.89 0 top
R41  10K  [R0603]  2 11.52 0 top
R42  10K  [R0603]  2 3.14 0 top
U1  b36a09645c1c406b9ecad4bc014d66a6  [SOT-23-5_L2.9-W1.5-P0.95-LS2.8-BL]  6.5 57.7 180 top
U2  b36a09645c1c406b9ecad4bc014d66a6  [SOT-23-5_L2.9-W1.5-P0.95-LS2.8-BL]  6.5 49.18 180 top
U3  b36a09645c1c406b9ecad4bc014d66a6  [SOT-23-5_L2.9-W1.5-P0.95-LS2.8-BL]  6.5 40.66 180 top
U4  b36a09645c1c406b9ecad4bc014d66a6  [SOT-23-5_L2.9-W1.5-P0.95-LS2.8-BL]  6.5 32.14 180 top
U5  b36a09645c1c406b9ecad4bc014d66a6  [SOT-23-5_L2.9-W1.5-P0.95-LS2.8-BL]  6.5 23.62 180 top
U6  b36a09645c1c406b9ecad4bc014d66a6  [SOT-23-5_L2.9-W1.5-P0.95-LS2.8-BL]  6.5 15.1 180 top
U7  b36a09645c1c406b9ecad4bc014d66a6  [SOT-23-5_L2.9-W1.5-P0.95-LS2.8-BL]  6.5 6.59 180 top
U8  -  [WingTAT-32PIN]  28 30 270 bottom

## Footprints (pads in the part's own frame, mm; a bottom-side part is the same pattern mirrored in y, then rotated)
C0603
  rect 0.8x0.9 smd: 1(-0.7,0) 2(0.7,0)
DFN-8_L3.0-W3.0-P0.65-BL
  rect 0.4x0.8 smd: 1(-0.975,-1.5) 2(-0.325,-1.5) 3(0.325,-1.5) 4(0.975,-1.5) 5(0.975,1.5) 6(0.325,1.5) 7(-0.325,1.5) 8(-0.975,1.5)
  rect 2.4x2.1 smd: 9(0,0.35)
LED_0603
  rect 0.8x0.8 smd: 1(-0.851,-0.01) 2(0.75,-0.005)
R0603
  rect 0.806x0.864 smd: 1(-0.753,0) 2(0.753,0)
RES-SMD_L6.4-W3.2_LR2512D-3W-1MR
  rect 2.5x3.6 smd: 1(-2.667,0) 2(2.667,0)
SOT-23-5_L2.9-W1.5-P0.95-LS2.8-BL
  rect 0.551x0.9 smd: 1(-0.95,-1.35) 2(0,-1.35) 3(0.95,-1.35)
  rect 0.55x0.9 smd: 4(0.95,1.35) 5(-0.95,1.35)
WingTAT-32PIN
  rect 1.6x6.5 smd: 1(-19.05,0.9) 3(-16.51,0.9) 5(-13.97,0.9) 7(-11.43,0.9) 9(-8.89,0.9) 11(-6.35,0.9) 13(-3.81,0.9) 15(-1.27,0.9) 17(1.27,0.9) 19(3.81,0.9) 21(6.35,0.9) 23(8.89,0.9) 25(11.43,0.9) 27(13.97,0.9) 29(16.51,0.9) 31(19.05,0.9)
  rect 1.6x6.5 smd far side: 2(-19.05,0.9) 4(-16.51,0.9) 6(-13.97,0.9) 8(-11.43,0.9) 10(-8.89,0.9) 12(-6.35,0.9) 14(-3.81,0.9) 16(-1.27,0.9) 18(1.27,0.9) 20(3.81,0.9) 22(6.35,0.9) 24(8.89,0.9) 26(11.43,0.9) 28(13.97,0.9) 30(16.51,0.9) 32(19.05,0.9)

## Nets
As in the schematic.

## Via types
v1: diameter 0.457, hole 0.203, Top Layer to Bottom Layer, 126 vias

## Routing (per net, layer and track width the routed paths; a pad name or vN(x,y) marks a point on that pad's centre or on a via; arc(x,y) is an arc through that point)
3V: length 4.3
  Top Layer w0.254: 7.05,14.72 v1(9.4,14.72) ; 7.05,14.72 6.5,15.27 v1(6.5,16.45)
  vias: v1(1.15,14.88) v1(1.25,16.61) v1(4.06,11.74) v1(4.06,10.85) v1(8.1,8.11) v1(8.05,7.27) v1(10.44,8.11) v1(10.44,7.27) v1(20.19,13.46) v1(20.19,11.83) v1(21.72,15.08) v1(21.72,13.46) v1(24.13,17.33) v1(29.97,17.33)
6V: length 4.3
  Top Layer w0.254: 7.05,23.23 6.5,23.78 v1(6.5,24.97) ; 7.05,23.23 v1(9.4,23.23)
  vias: v1(1.15,23.25) v1(1.2,24.99) v1(4.06,20.25) v1(4.06,19.36) v1(8.1,16.63) v1(8.1,15.95) v1(10.46,16.63) v1(10.46,15.95) v1(20.19,19.36) v1(20.19,17.74) v1(21.72,20.99) v1(21.72,19.36) v1(24.13,22.41) v1(29.97,22.41)
9V: length 4.3
  Top Layer w0.254: v1(6.5,33.49) 6.5,32.29 7.05,31.74 v1(9.4,31.74)
  vias: v1(1.15,31.63) v1(1.25,33.37) v1(3.94,28.76) v1(3.94,27.87) v1(8.1,25.15) v1(8.1,24.47) v1(10.45,25.15) v1(10.45,24.47) v1(20.19,24.82) v1(21.72,26.44) v1(21.72,24.82) v1(24.13,27.49) v1(29.97,27.49)
12V: length 4.3
  Top Layer w0.254: v1(9.4,40.25) 7.05,40.25 6.5,40.8 v1(6.5,42.01)
  vias: v1(1.15,40.01) v1(1.25,41.75) v1(3.94,37.27) v1(3.94,36.38) v1(8.1,33.67) v1(8.1,32.99) v1(10.45,33.66) v1(10.45,32.99) v1(20.19,33.46) v1(21.72,33.46) v1(21.72,31.84) v1(24.13,32.57) v1(29.97,32.57)
15V: length 4.3
  Top Layer w0.254: v1(9.4,48.76) 7.05,48.76 6.5,49.31 v1(6.5,50.53)
  vias: v1(1.15,48.38) v1(1.25,50.12) v1(4.06,45.9) v1(4.06,44.89) v1(8.1,42.19) v1(8.1,41.51) v1(10.44,42.19) v1(10.44,41.51) v1(20.19,40.57) v1(20.19,38.95) v1(21.72,38.95) v1(21.72,37.27) v1(24.13,37.65) v1(29.97,37.65)
18V: length 4.4
  Top Layer w0.254: v1(6.5,59.05) 6.5,57.82 7.05,57.27 v1(9.4,57.27)
  vias: v1(1.15,56.76) v1(1.25,58.5) v1(3.94,54.41) v1(3.94,53.4) v1(8.1,50.58) v1(8.05,49.9) v1(10.41,50.6) v1(10.41,49.94) v1(20.19,46.54) v1(20.19,45.08) v1(21.72,45.08) v1(21.72,43.51) v1(24.13,42.73) v1(29.97,42.73)
GND: length 4.5
  Top Layer w0.254: v1(9.4,6.09) 6.92,6.09 6.5,6.51 v1(6.5,7.94)
  vias: v1(1.15,6.5) v1(1.25,8.24) v1(3.94,3.49) v1(3.94,2.6) v1(24.13,12.25) v1(29.97,12.25)
VCC:
  vias: v1(8.1,59.22) v1(8.1,58.55) v1(10.41,59.24) v1(10.41,58.54) v1(20.19,57.71) v1(20.19,53.4) v1(20.83,51.36) v1(21.72,49.08) v1(24.13,47.81) v1(29.97,47.81)
$1N349: length 3
  Top Layer w0.254: U1.3 5,58.5 R1.2
$1N404: length 2.3
  Top Layer w0.254: R15.2 1.25,55.27 LED1.2
$1N437: length 3.5
  Top Layer w0.254: U1.4 3.84,56.35 2.75,55.26 R15.1
$1N622: length 8.8
  Top Layer w0.254: v1(3.94,55.56) 6.66,55.56 U1.5
  Bottom Layer w0.254: v1(3.94,55.56) 1.27,52.89 v1(1.27,51.75)
$1N3309: length 3
  Top Layer w0.254: R2.2 5.14,50.12 5.55,50.53
$1N3311: length 2.3
  Top Layer w0.254: R16.2 1.25,46.89 LED2.2
$1N3313: length 3.3
  Top Layer w0.254: U2.4 3.92,47.83 R16.1
$1N3315: length 8.6
  Top Layer w0.254: v1(4.06,47.05) 6.67,47.05 U2.5
  Bottom Layer w0.254: v1(4.06,47.05) 1.27,44.25 v1(1.27,43.36)
$1N3959: length 2.9
  Top Layer w0.254: U3.3 5.28,41.75 R3.2
$1N3961: length 2.3
  Top Layer w0.254: R17.2 1.25,38.51 LED3.2
$1N3963: length 3.2
  Top Layer w0.254: U3.4 3.78,39.31 R17.1
$1N3965: length 8.5
  Top Layer w0.254: U3.5 6.68,38.54 v1(3.94,38.54)
  Bottom Layer w0.254: v1(1.27,34.98) 1.27,35.87 v1(3.94,38.54)
$1N4001: length 2.8
  Top Layer w0.254: R4.2 5.43,33.37 U4.3
$1N4003: length 2.3
  Top Layer w0.254: R18.2 1.25,30.13 LED4.2
$1N4005: length 3.2
  Top Layer w0.254: U4.4 3.64,30.79 R18.1
$1N4007: length 8.4
  Top Layer w0.254: U4.5 6.69,30.03 v1(3.94,30.03)
  Bottom Layer w0.254: v1(1.27,26.6) 1.27,27.36 v1(3.94,30.03)
$1N4651: length 2.8
  Top Layer w0.254: R5.2 2.77,24.97 U5.3
$1N4653: length 2.3
  Top Layer w0.254: LED5.2 1.25,21.76 R19.2
$1N4655: length 3.1
  Top Layer w0.254: R19.1 3.49,22.27 5.55,22.27
$1N4657: length 8.3
  Top Layer w0.254: 7.45,22.27 7.45,22.1 6.87,21.52 v1(4.06,21.52)
  Bottom Layer w0.254: v1(4.06,21.52) 1.27,18.72 v1(1.27,18.22)
$1N4693: length 2.9
  Top Layer w0.254: U6.3 2.91,16.45 R6.2
$1N4695: length 2.3
  Top Layer w0.254: LED6.2 1.25,13.38 R20.2
$1N4697: length 3
  Top Layer w0.254: R20.1 3.35,13.75 U6.4
$1N4699: length 8.1
  Top Layer w0.254: U6.5 7.45,13.58 6.88,13.01 v1(4.06,13.01)
  Bottom Layer w0.254: v1(1.27,9.84) 1.27,10.22 v1(4.06,13.01)
$1N5343: length 2.9
  Top Layer w0.254: U7.3 5.25,8.24 R7.2
$1N5345: length 2.3
  Top Layer w0.254: R21.2 1.25,5 LED7.2
$1N5347: length 3
  Top Layer w0.254: R21.1 3.21,5.24 U7.4
$1N5349: length 8.1
  Top Layer w0.254: U7.5 7.45,5.06 6.9,4.51 3.94,4.51 v1(3.94,4.5)
  Bottom Layer w0.254: v1(3.94,4.5) 1.27,1.83 v1(1.27,1.45)

## Copper pours and planes (outline as drawn; the poured copper is in the pictures)
3V on Top Layer: 7.1,8.86 10.81,8.86 10.81,6.78 7.1,6.78
3V on Top Layer: 16.38,4.63 16.38,8.82 18.92,8.82 19.18,9.07 19.18,13.14 21.08,15.04 21.08,16.95 23.88,19.74 30.48,19.74 30.48,14.79 23.88,14.79 23.5,14.41 23.5,9.2 18.92,4.63
3V on Top Layer: 2.37,12.18 5.4,12.18 5.4,10.3 3.94,10.3 3.38,10.86 3.38,10.9 3.3,10.98 2.37,10.98
3V on Bottom Layer: 30.48,19.87 23.75,19.87 19.3,15.42 7.12,15.42 7.12,17.7 7.11,17.71 -0.89,17.71 -0.89,11.24 -1.14,10.98 -1.02,10.85 -1.02,9.33 7.1,9.33 7.1,6.8 7.11,6.79 15.88,6.79 23.88,14.79 30.48,14.79
6V on Top Layer: 7.1,17.69 10.81,17.69 10.81,15.42 7.1,15.42
6V on Top Layer: 30.48,24.69 24,24.69 18.92,19.62 18.92,16.95 16.38,16.95 16.38,13.26 19.37,13.26 21.19,15.08 21.19,16.91 24.15,19.87 30.48,19.87
6V on Top Layer: 5.4,20.51 5.4,18.81 3.97,18.81 3.38,19.39 2.33,19.39 2.33,20.52 5.39,20.52
6V on Bottom Layer: 30.48,24.95 23.88,24.95 22.86,23.93 7.1,23.93 7.1,26.09 -1.14,26.09 -1.14,17.71 7.1,17.71 7.1,15.43 7.11,15.42 19.3,15.42 23.75,19.87 30.48,19.87
9V on Top Layer: 7.11,25.96 10.81,25.96 10.81,23.92 7.11,23.92
9V on Top Layer: 16.38,25.84 18.92,25.84 22.86,29.77 30.48,29.77 30.48,24.95 23.88,24.95 20.57,21.65 16.38,21.65
9V on Top Layer: 5.4,29.03 5.4,27.33 3.87,27.33 3.38,27.82 2.34,27.82 2.34,29.03
9V on Bottom Layer: 30.48,29.77 22.73,29.77 20.07,32.44 7.03,32.44 7.03,34.35 -0.38,34.35 -0.51,34.47 -0.51,26.22 -0.38,26.09 7.1,26.09 7.1,23.94 7.12,23.92 22.85,23.92 23.88,24.95 30.48,24.95
12V on Top Layer: 30.48,34.85 30.48,30 16.39,30 16.38,30.01 16.38,33.97 21.34,33.97 22.22,34.85
12V on Top Layer: 7.12,34.88 10.81,34.88 10.81,32.43 7.12,32.43
12V on Top Layer: 5.4,37.56 5.4,35.87 2.67,35.87 2.29,36.25 2.29,37.56
12V on Bottom Layer: 30.48,34.85 22.35,34.85 16.51,40.7 16.51,40.82 7,40.82 7,42.73 -0.3,42.73 -0.3,34.44 7.11,34.44 7.11,32.44 20.06,32.44 22.5,30 30.48,30
15V on Top Layer: 5.4,44.37 2.42,44.37 2.29,44.51 2.29,46.08 3.86,46.08 3.94,46.16 5.41,46.16 5.41,44.38
15V on Top Layer: 16.38,42.6 16.38,38.41 18.8,38.41 18.92,38.54 22.35,35.11 30.48,35.11 30.48,40.06 23.75,40.06 21.21,42.6
15V on Top Layer: 7.1,43.35 10.89,43.35 10.89,40.94 7.1,40.94
15V on Bottom Layer: 30.48,39.93 23.75,39.93 14.47,49.21 6.96,49.21 6.96,51.09 6.99,51.11 -0.64,51.11 -0.64,42.73 7.09,42.73 7.09,40.95 16.51,40.95 22.35,35.11 30.48,35.11
18V on Top Layer: 7.11,52.17 10.81,52.17 10.81,49.45 7.11,49.45
18V on Top Layer: 5.38,54.69 3.7,54.69 3.04,54.03 2.43,54.03 2.29,53.9 2.28,53.9 2.28,53.02 2.41,52.89 5.38,52.89
18V on Top Layer: 16.38,51.11 16.38,46.92 18.92,46.92 19.05,46.79 19.05,45.01 23.88,40.19 30.48,40.19 30.48,45.14 23.75,45.14 20.83,48.06 20.83,49.2 18.92,51.11
18V on Bottom Layer: 30.48,45.01 23.5,45.01 10.81,57.7 7,57.7 6.99,57.71 6.99,60.64 -0.97,60.64 -0.97,51.24 7.1,51.24 7.1,49.46 14.6,49.46 23.88,40.19 30.48,40.19
GND on Top Layer: 5.4,3.87 2.34,3.87 2.34,2.48 3.29,2.48 3.93,1.77 5.4,1.77
GND on Top Layer: 23.75,14.41 30.48,14.41 30.48,8.18 23.75,8.18
GND on Bottom Layer: -2.16,14.79 30.48,14.79 30.48,-1.47 -2.16,-1.47
VCC on Top Layer: 30.48,45.27 23.5,45.27 16.38,52.38 16.38,60.64 30.48,60.64
VCC on Top Layer: 7.11,60.51 10.81,60.51 10.81,57.96 7.11,57.96
VCC on Bottom Layer: 30.48,45.27 23.5,45.27 10.81,57.96 7.12,57.96 7.11,57.97 7.11,60.51 30.48,60.51
$1N3003 on Top Layer: 11.05,59.62 11.05,55.56 13.59,55.56 13.84,55.3 13.84,51.49 19.05,51.49 19.05,55.3 16.13,55.3 16.13,59.62
$1N3349 on Top Layer: 11.05,51.1 11.05,47.03 13.59,47.03 13.84,46.78 13.84,42.97 19.05,42.97 19.05,46.78 16.13,46.78 16.13,51.1
$1N3999 on Top Layer: 11.05,42.57 11.05,38.51 13.59,38.51 13.84,38.25 13.84,34.44 19.05,34.44 19.05,38.25 16.13,38.25 16.13,42.57
$1N4041 on Top Layer: 11.05,34.05 11.05,29.99 13.59,29.99 13.84,29.73 13.84,25.92 19.05,25.92 19.05,29.73 16.13,29.73 16.13,34.05
$1N4691 on Top Layer: 11.05,25.53 11.05,21.46 13.59,21.46 13.84,21.21 13.84,17.4 19.05,17.4 19.05,21.21 16.13,21.21 16.13,25.53
$1N4733 on Top Layer: 10.81,17.12 19.19,17.12 19.19,8.79 10.81,8.79
$1N5351 on Top Layer: 0.62,3.8 5.39,3.8 5.39,0.8 0.62,0.8
$1N5383 on Top Layer: 11.05,8.48 11.05,4.42 13.59,4.42 13.84,4.16 13.84,0.35 19.05,0.35 19.05,4.16 16.13,4.16 16.13,8.48
$1N15313 on Top Layer: 5.72,4.16 13.59,4.16 13.59,0.23 5.72,0.23
$1N15636 on Top Layer: 0.62,12.18 5.39,12.18 5.39,9.32 0.62,9.32
$1N15639 on Top Layer: 5.72,12.69 13.59,12.69 13.59,8.75 5.72,8.75
$1N16130 on Top Layer: 0.62,54.06 5.42,54.06 5.42,51.1 0.62,51.1
$1N16133 on Top Layer: 5.72,55.3 13.59,55.3 13.59,51.36 5.72,51.36
$1N16291 on Top Layer: 0.62,45.69 5.46,45.69 5.46,42.73 0.62,42.73
$1N16294 on Top Layer: 5.72,46.78 13.59,46.78 13.59,42.84 5.72,42.84
$1N16454 on Top Layer: 0.62,37.31 5.46,37.31 5.46,34.35 0.62,34.35
$1N16457 on Top Layer: 5.72,38.25 13.59,38.25 13.59,34.32 5.72,34.32
$1N16617 on Top Layer: 0.62,28.93 5.46,28.93 5.46,26.22 0.62,26.22
$1N16620 on Top Layer: 5.72,29.73 13.59,29.73 13.59,25.8 5.72,25.8
$1N16780 on Top Layer: 0.62,20.55 5.4,20.55 5.4,17.84 0.62,17.84
$1N16783 on Top Layer: 5.72,21.21 13.59,21.21 13.59,17.27 5.72,17.27

## Text on the board
Document Layer: WingTAT金手指 / 使用1.6板厚
Top Silkscreen Layer: 21V | 3V

# Board 散热片
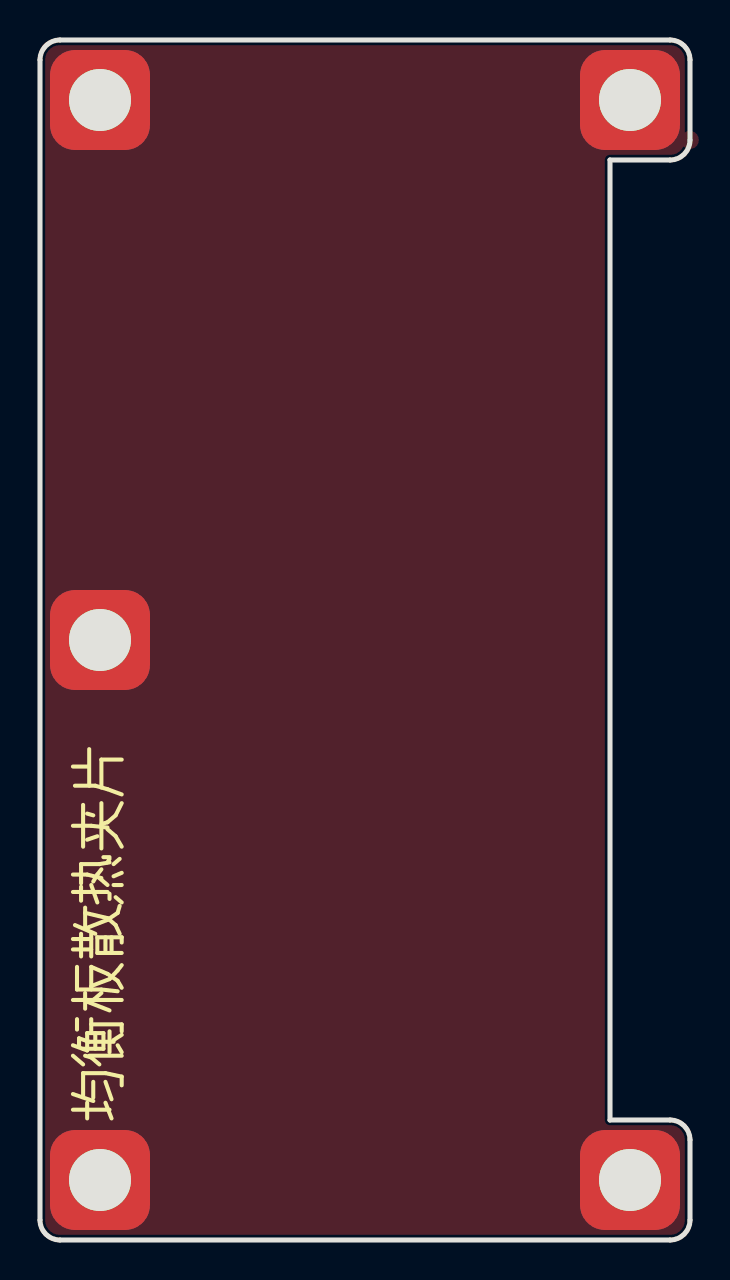
[diagram p7: board, top side]
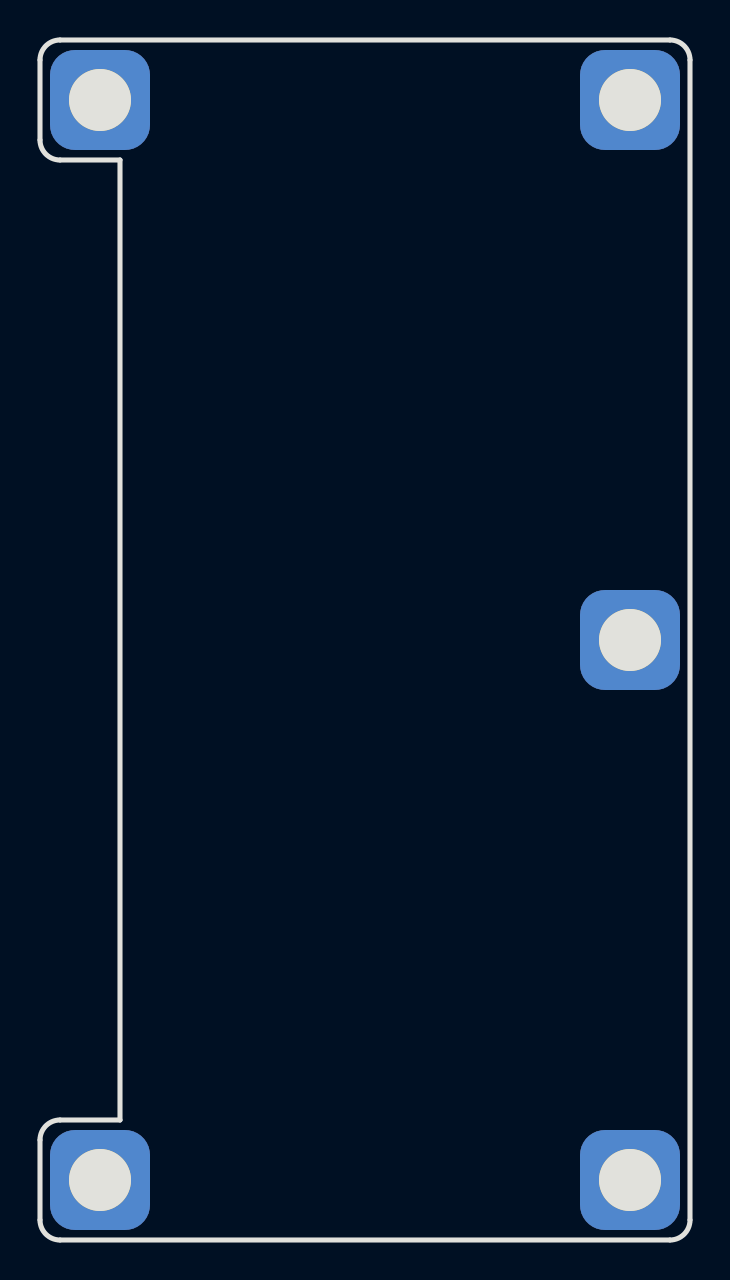
[diagram p8: board, bottom side, seen from below]

Outline 32.5 x 60 mm; copper layers: Top Layer, Bottom Layer. Coordinates in mm from the lower left corner of the outline.
Outline path: 0,59 0,1 arc(0.29,0.29) 1,0 31.5,0 arc(32.21,0.29) 32.5,1 32.5,5 arc(32.21,5.71) 31.5,6 28.5,6 28.5,54 31.5,54 arc(32.21,54.29) 32.5,55 32.5,59 arc(32.21,59.71) 31.5,60 1,60 arc(0.29,59.71) 0,59
Stack: Top Layer 0.035mm / Bottom Layer 0.035mm

## Design rules (mm)
spacing copperThickness1oz (default): track to track 0.102, other pairs 0.152 to 0.3
spacing copperThickness2oz: track to track 0.203, other pairs 0.152 to 0.3
spacing Plane_innerPlane: track to track 0.102, other pairs 0.152 to 0.3
spacing Copper_copperRegion: track to track 0.102, other pairs 0.152 to 0.3
spacing Copper_全连接: track to track 0.102, other pairs 0.152 to 0.3
track width copperThickness1oz (default): min 0.127, default 0.254, max 2.54
track width copperThickness2oz: min 0.203, default 0.254, max 2.54
differential pair differentialPair (default): width min 0.127, default 0.254, max 2.54; gap min 0.152, default 0.152
pour e2 uses 全连接

## Placement (name value [footprint] x y rotation side)
U1  -  [m2.5直径4.5高4孔3深1.2pcb螺母]  3 57 0 top
U2  -  [m2.5直径4.5高4孔3深1.2pcb螺母]  3 30 0 top
U3  -  [m2.5直径4.5高4孔3深1.2pcb螺母]  3 3 0 top
U4  -  [m2.5直径4.5高4孔3深1.2pcb螺母]  29.5 57 0 top
U5  -  [m2.5直径4.5高4孔3深1.2pcb螺母]  29.5 3 0 top

## Footprints (pads in the part's own frame, mm; a bottom-side part is the same pattern mirrored in y, then rotated)
m2.5直径4.5高4孔3深1.2pcb螺母
  rrect 5x5 hole 3.1: 1(0,0)

## Nets
As in the schematic.

## Copper pours and planes (outline as drawn; the poured copper is in the pictures)
GND on Top Layer: -4.03,62.41 39.28,62.41 39.28,-3.75 -4.03,-3.75

## Text on the board
Document Layer: 散热夹片使用铝基板进行打样
Top Silkscreen Layer: 均衡板散热夹片
